# EasyEDA Pro project STM32H723_LTS_2026-05-05.epro, board PCB1
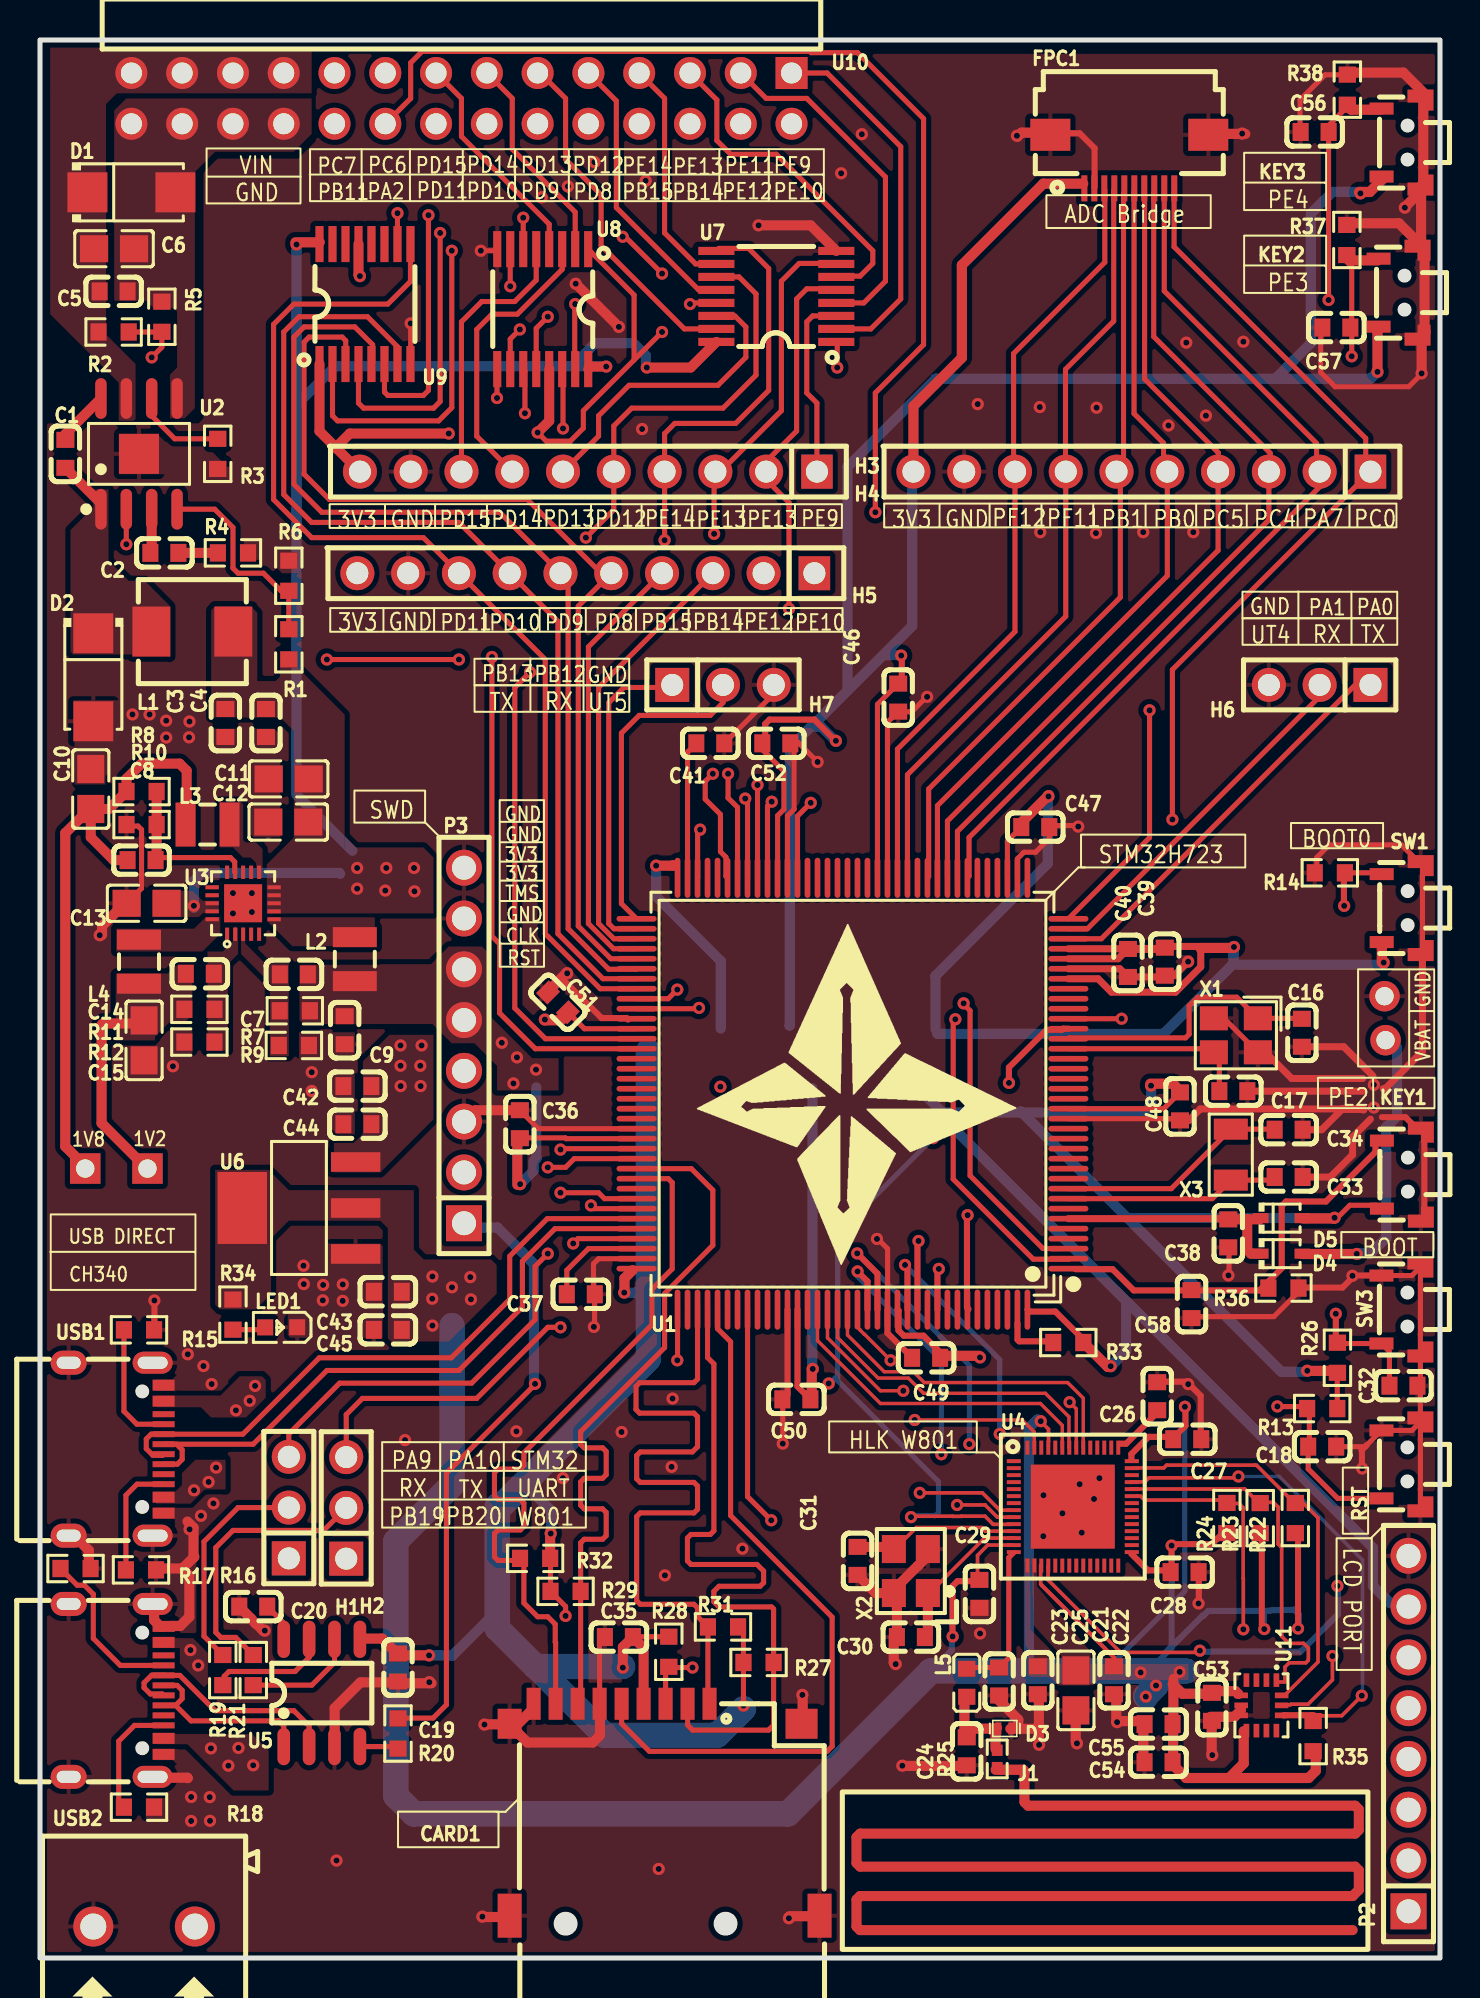
[diagram p4: board, top side]
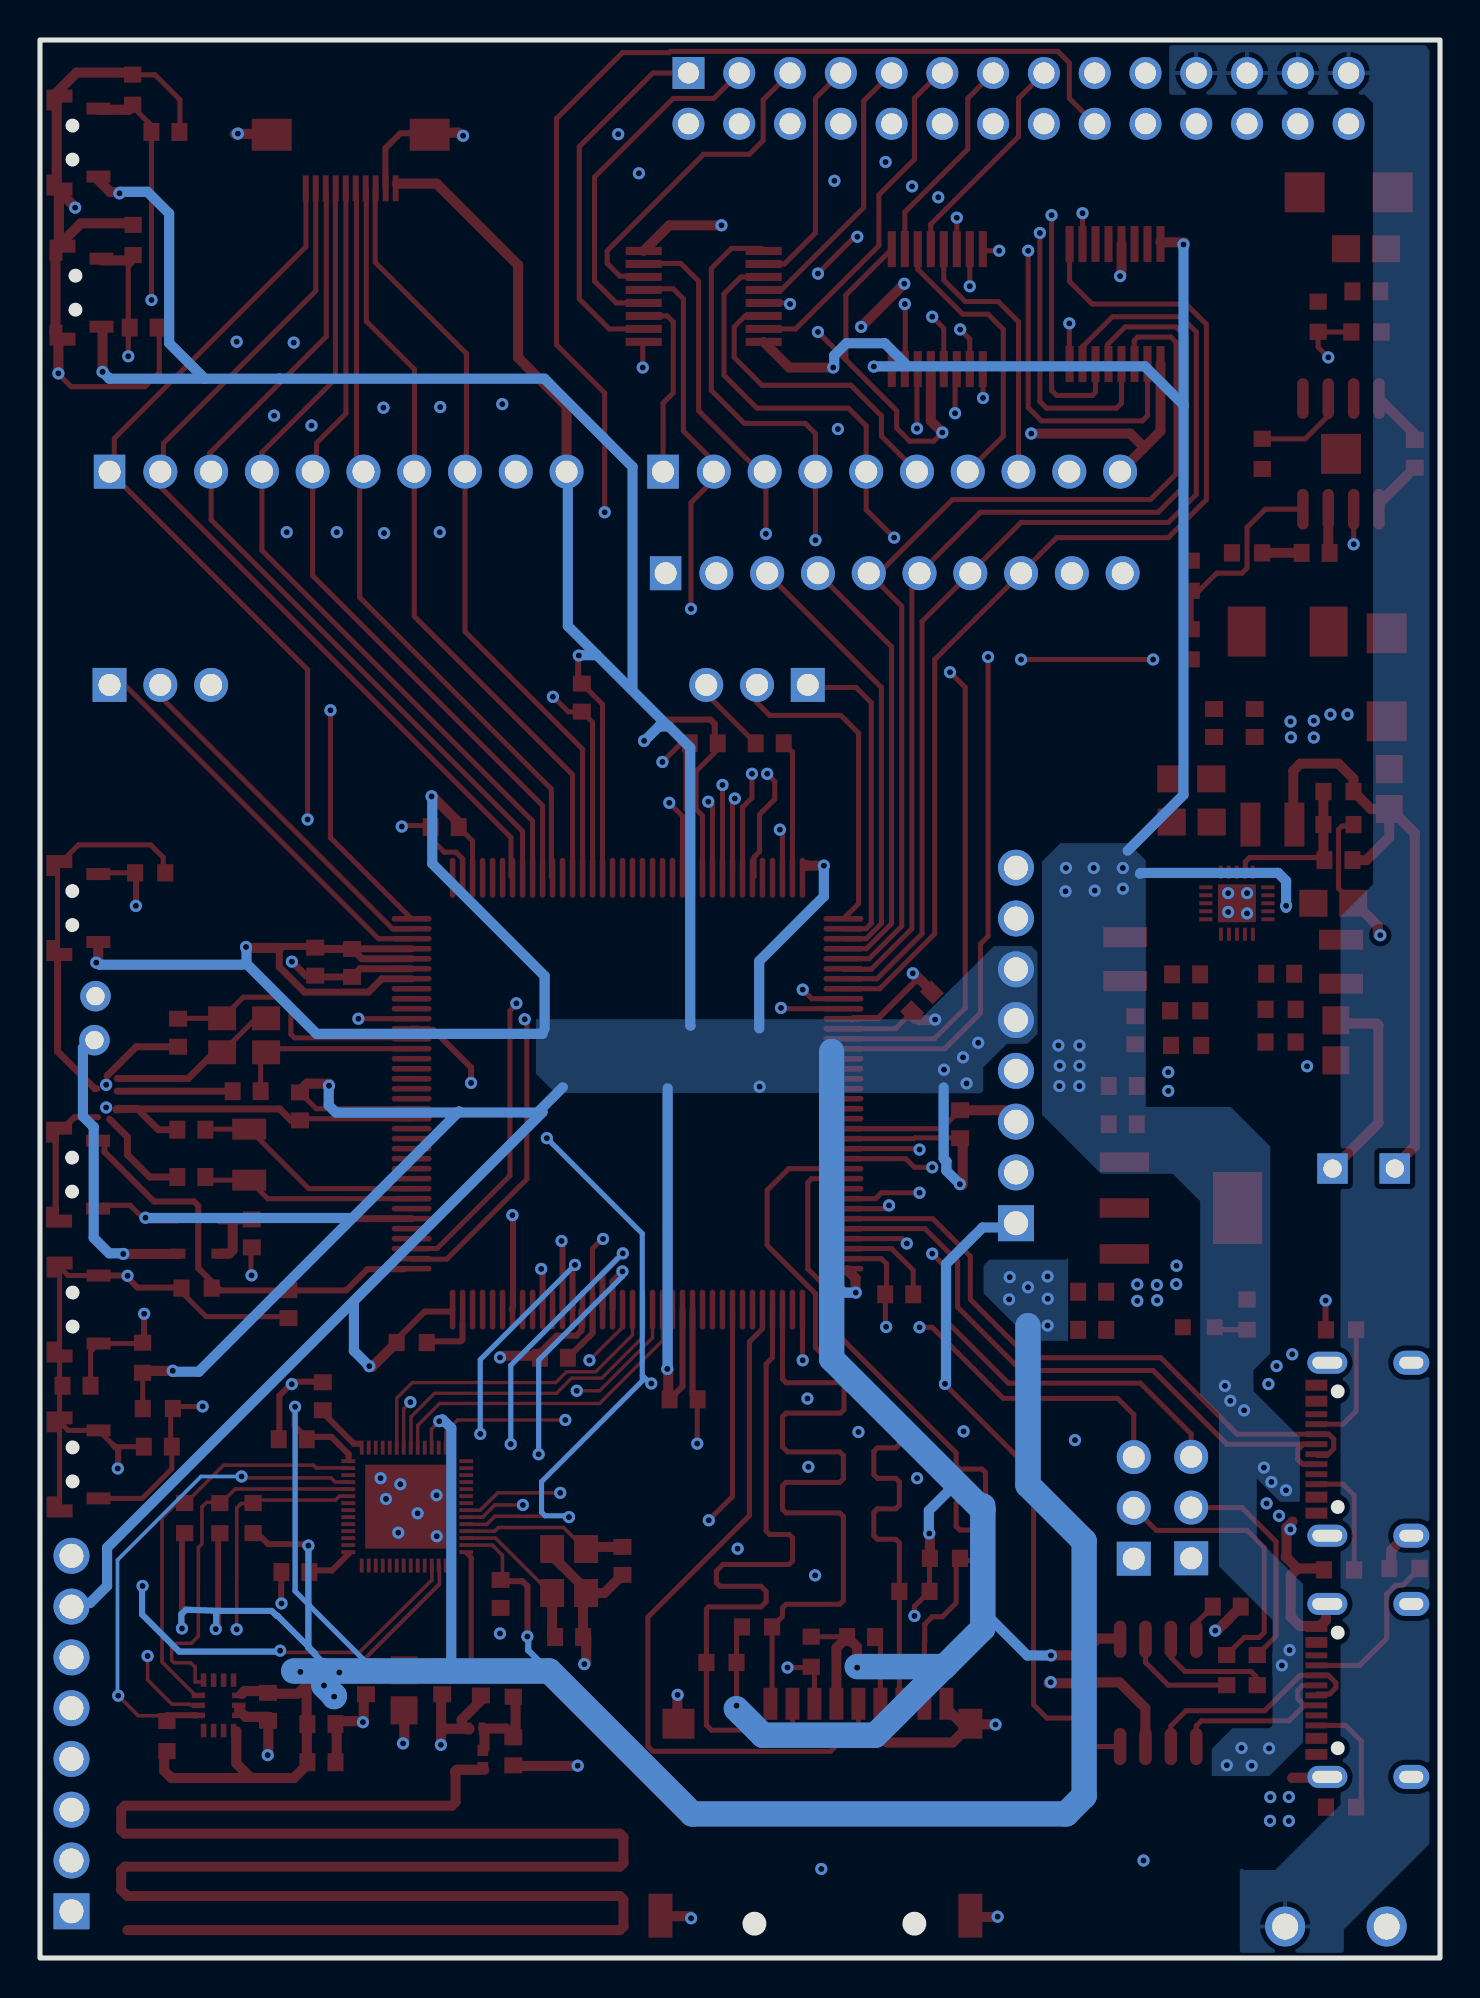
[diagram p5: board, bottom side, seen from below]

Outline 70.03 x 95.94 mm; copper layers: Top Layer, 内层1, 内层2, Bottom Layer. Coordinates in mm from the lower left corner of the outline.
Outline path: rectangle 0,95.94 70.03,0
Stack: Top Layer 0.035mm 外层铜厚1oz / Dielectric1 0.2104mm 7628 RC49% 8.6mil / 内层1 0.0152mm 内层铜厚 / Dielectric2 1.065mm 1.1mm H/HOZ Copper / 内层2 0.0152mm 内层铜厚 / Dielectric3 0.2104mm 7628 RC49% 8.6mil / Bottom Layer 0.035mm 外层铜厚1oz

## Design rules (mm)
template: JLCPCB Capability(Two Layers Board)
spacing copperThickness1oz (default): track to track 0.102, other pairs 0.152 to 0.3
spacing copperThickness2oz: track to track 0.203, other pairs 0.152 to 0.3
track width copperThickness1oz (default): min 0.127, default 0.254, max 2.54
track width copperThickness2oz: min 0.203, default 0.254, max 2.54
differential pair differentialPair (default): width min 0.127, default 0.254, max 2.54; gap min 0.152, default 0.152
via viaSize (default): diameter min 0.5, default 0.61, max 10; hole min 0.3, default 0.305, max 6.3

## Placement (name value [footprint] x y rotation side)
C1  100nF  [C0603]  1.27 75.24 270 top
C2  100pF  [C0603]  6.22 70.28 180 top
C3  100nF  [C0603]  9.27 61.77 90 top
C4  10uF  [C0603]  11.3 61.77 90 top
C5  100nF  [C0603]  3.68 83.36 180 top
C6  22uF  [C0805]  3.7 85.5 180 top
C7  18pF  [C0603]  12.7 49.2 0 top
C8  22pF  [C0603]  5.08 54.92 180 top
C9  10uF  [C0603]  15.24 46.41 90 top
C10  22uF  [C0805]  2.54 58.47 270 top
C11  22uF  [C0805]  12.44 58.98 0 top
C12  22uF  [C0805]  12.42 56.82 0 top
C13  22uF  [C0805]  5.33 52.76 0 top
C14  22pF  [C0603]  7.99 49.23 180 top
C15  22uF  [C0805]  5.21 45.9 90 top
C16  20pF  [C0603]  63.12 46.28 270 top
C17  20pF  [C0603]  59.69 43.36 180 top
C18  100nF  [C0603]  64.14 25.58 0 top
C19  100nF  [C0603]  17.91 14.53 90 top
C20  100nF  [C0603]  10.67 17.58 0 top
C21  47uF  [C0805]  51.82 13.39 90 top
C22  10uF  [C0603]  53.72 13.89 270 top
C23  1.8pF  [C0603]  47.98 13.83 90 top
C24  1pF  [C0603]  46.36 10.34 90 top
C25  10nF  [C0603]  49.91 13.89 90 top
C26  1uF  [C0603]  55.88 28.1 90 top
C27  1uF  [C0603]  57.39 25.95 0 top
C28  1uF  [C0603]  57.25 19.3 0 top
C29  1uF  [C0603]  46.99 18.21 270 top
C30  27pF  [C0603]  43.56 16.05 0 top
C31  27pF  [C0603]  40.89 19.86 270 top
C32  100nF  [C0603]  68.2 28.63 0 top
C33  20pF  [C0603]  62.46 39.06 0 top
C34  20pF  [C0603]  62.46 41.43 0 top
C35  10uF  [C0603]  28.96 16.05 0 top
C36  1uF  [C0603]  24 41.71 270 top
C37  4.7uF  [C0603]  27.05 33.2 0 top
C38  100nF  [C0603]  59.44 36.25 270 top
C39  10uF  [C0603]  56.26 49.84 270 top
C40  100nF  [C0603]  54.42 49.77 90 top
C41  4.7uF  [C0603]  33.53 60.76 180 top
C42  10uF  [C0603]  15.88 43.61 180 top
C43  10uF  [C0603]  17.4 33.33 180 top
C44  100nF  [C0603]  15.88 41.71 180 top
C45  100nF  [C0603]  17.4 31.42 180 top
C46  100nF  [C0603]  42.93 63.04 90 top
C47  100nF  [C0603]  49.78 56.57 180 top
C48  100nF  [C0603]  57.02 42.6 90 top
C49  100nF  [C0603]  44.32 30.02 0 top
C50  100nF  [C0603]  37.83 27.94 0 top
C51  100nF  [C0603]  25.91 47.8 315 top
C52  100nF  [C0603]  36.83 60.76 180 top
C53  10uF  [C0603]  58.62 12.56 90 top
C54  100nF  [C0603]  55.95 9.79 0 top
C55  2.2uF  [C0603]  55.95 11.7 0 top
C56  100nF  [C0603]  63.76 91.34 180 top
C57  100nF  [C0603]  64.84 81.55 0 top
C58  100nF  [C0603]  57.6 32.71 270 top
CARD1  TF PUSH  [TF-SMD_TF-PUSH]  31.24 7.42 0 top
D1  SS34  [SMA_L4.3-W2.6-LS5.2-RD]  4.57 88.32 0 top
D2  SS34  [SMA_L4.3-W2.6-LS5.2-RD]  2.67 64.06 270 top
D3  H5VL10B  [SOD-882_L1.0-W0.6-BI]  48.26 11.48 180 top
D4  B5819WS  [SOD-323_L1.7-W1.3-LS2.5-FD]  62.1 35.23 180 top
D5  B5819WS  [SOD-323_L1.7-W1.3-LS2.5-FD]  62.1 37.01 180 top
FPC1  AFC01-S10FCA-00  [FPC-SMD_P0.5-10P_FGS-XJ-H2.0]  54.49 89.85 0 top
H1  PZ254V-11-03P  [HDR-TH_3P-P2.54-V-M]  12.45 22.53 90 top
H2  PZ254V-11-03P  [HDR-TH_3P-P2.54-V-M]  15.32 22.52 90 top
H3  PZ254V-11-10P  [HDR-TH_10P-P2.54-V-M]  55.12 74.35 180 top
H4  PZ254V-11-10P  [HDR-TH_10P-P2.54-V-M]  27.43 74.35 180 top
H5  PZ254V-11-10P  [HDR-TH_10P-P2.54-V-M]  27.3 69.27 180 top
H6  PZ254V-11-03P  [HDR-TH_3P-P2.54-V-M]  64.01 63.68 180 top
H7  PZ254V-11-03P  [HDR-TH_3P-P2.54-V-M]  34.16 63.68 0 top
J1  Component_1  [TX1]  49.24 9.25 0 top
KEY1  TS24CA  [SW-SMD_TS24CA]  68.1 39.18 270 top
KEY2  TS24CA  [SW-SMD_TS24CA]  67.93 83.3 270 top
KEY3  TS24CA  [SW-SMD_TS24CA]  68.08 90.81 270 top
L1  4.7uH  [IND-SMD_L5.4-W5.2_FXL0530]  7.62 66.35 0 top
L2  2.2uH  [IND-SMD_L2.5-W2.0_MHCHL2520]  15.75 49.96 270 top
L3  2.2uH  [IND-SMD_L2.5-W2.0_MHCHL2520]  8.38 56.69 180 top
L4  2.2uH  [IND-SMD_L2.5-W2.0_MHCHL2520]  4.95 49.84 270 top
L5  3nH  [L0603]  46.36 13.77 90 top
LED1  NCD0603R1  [LED0603-RD_RED]  12.06 31.55 180 top
NOREF  -  [Pad_e2978]  67.25 48.11 0 top
NOREF#2  -  [Pad_e5774]  5.38 39.49 0 top
NOREF#3  -  [Pad_e5768]  2.26 39.49 0 top
NOREF#4  -  [Pad_e2976]  67.3 45.91 0 top
P1  WJ500V-5.08-2P  [CONN-TH_2P-P5.00_WJ500V-5.08-2P]  5.21 1.58 180 top
P2  2.54-1*8P母环保  [HDR-TH_8P-P2.54-V-F-1]  68.45 11.23 90 top
P3  2.54-1*8P母环保  [HDR-TH_8P-P2.54-V-F-1]  21.21 45.64 90 top
R1  500kΩ  [R0603]  12.45 65.71 270 top
R2  100kΩ  [R0603]  3.68 81.33 180 top
R3  100kΩ  [R0603]  8.89 75.24 90 top
R4  100kΩ  [R0603]  9.65 70.28 180 top
R5  100kΩ  [R0603]  6.1 82.09 270 top
R6  100kΩ  [R0603]  12.45 69.14 270 top
R7  680kΩ  [R0603]  12.75 47.38 0 top
R8  300kΩ  [R0603]  5.08 58.34 180 top
R9  150kΩ  [R0603]  12.7 45.64 180 top
R10  150kΩ  [R0603]  5.08 56.69 0 top
R11  150kΩ  [R0603]  7.97 47.45 180 top
R12  150kΩ  [R0603]  7.97 45.81 0 top
R13  10kΩ  [R0603]  64.14 27.48 0 top
R14  10kΩ  [R0603]  64.52 54.28 0 top
R15  5.1kΩ  [R0603]  4.95 31.42 180 top
R16  5.1kΩ  [R0603]  5.05 19.41 180 top
R17  5.1kΩ  [R0603]  1.78 19.48 180 top
R18  5.1kΩ  [R0603]  4.95 7.54 180 top
R19  510Ω  [R0603]  9.14 14.4 90 top
R20  10kΩ  [R0603]  17.91 11.23 270 top
R21  510Ω  [R0603]  10.67 14.4 90 top
R22  10kΩ  [R0603]  62.79 22.01 90 top
R23  10kΩ  [R0603]  61.03 22 90 top
R24  10kΩ  [R0603]  59.37 22.01 90 top
R25  0Ω  [R0402]  47.88 9.96 90 top
R26  10kΩ  [R0603]  64.9 30.02 270 top
R27  10kΩ  [R0603]  35.94 14.78 0 top
R28  10kΩ  [R0603]  31.45 15.32 270 top
R29  10kΩ  [R0603]  26.29 18.34 0 top
R31  10kΩ  [R0603]  34.16 16.56 180 top
R32  10kΩ  [R0603]  24.77 19.99 180 top
R33  10kΩ  [R0603]  51.43 30.79 0 top
R34  470Ω  [R0603]  9.65 32.18 90 top
R35  10kΩ  [R0603]  63.68 11.1 90 top
R36  10kΩ  [R0603]  62.2 33.51 180 top
R37  10kΩ  [R0603]  65.37 85.93 270 top
R38  10kΩ  [R0603]  65.39 93.45 270 top
RST  TS24CA  [SW-SMD_TS24CA]  68.07 24.69 270 top
SW1  TS24CA  [SW-SMD_TS24CA]  68.09 52.52 270 top
SW3  TS24CA  [SW-SMD_TS24CA]  68.07 32.44 270 top
U1  STM32H723ZGT6  [LQFP-144_L20.0-W20.0-P0.50-LS22.0-BL]  40.64 43.23 90 top
U2  MP1584EN-LF-Z  [SOIC-8_L5.0-W4.0-P1.27-LS6.0-BL-EP2.0]  4.95 75.24 0 top
U3  TMI7003C  [QFN-20_L3.0-W3.0-P0.40-BL-EP1.9]  10.16 52.76 0 top
U4  W801_QFN56  [QFN-56]  51.66 22.58 0 top
U5  CH340N  [SOP-8_L4.9-W3.9-P1.27-LS6.0-BL]  14.1 13.26 0 top
U6  AMS1117-3.3  [SOT-223-4_L6.5-W3.5-P2.30-LS7.0-BR]  12.95 37.52 0 top
U7  CD4504BPWR  [TSSOP-16_L5.0-W4.4-P0.65-LS6.4-TL]  36.83 83.11 180 top
U8  CD4504BPWR  [TSSOP-16_L5.0-W4.4-P0.65-LS6.4-TL]  25.15 82.47 270 top
U9  CD4504BPWR  [TSSOP-16_L5.0-W4.4-P0.65-LS6.4-TL]  16.26 82.73 90 top
U10  PZ254-2-14-W-2.5-G1  [HDR-TH_28P-P2.54-H-M-R2-C14-S2.54]  21.08 93.02 180 top
U11  ICM-42688-P  [LGA-14_L3.0-W2.5-P0.50-TL]  61.09 12.64 270 top
USB1  TYPE-C 16PIN 2MD(073)  [USB-C-SMD_TYPE-C-6PIN-2MD-073]  3.81 25.45 270 top
USB2  TYPE-C 16PIN 2MD(073)  [USB-C-SMD_TYPE-C-6PIN-2MD-073]  3.81 13.39 270 top
X1  25MHz  [CRYSTAL-SMD_4P-L3.2-W2.5-BL]  59.82 46.15 180 top
X2  40MHz  [OSC-SMD_4P-L3.2-W2.5-BL_SIT8008BI]  43.56 19.36 90 top
X3  32.768kHz  [CRYSTAL-SMD_L3.2-W1.5-1]  59.56 40.18 270 top

## Footprints (pads in the part's own frame, mm; a bottom-side part is the same pattern mirrored in y, then rotated)
C0603
  rect 0.8x0.9 smd: 1(-0.7,0) 2(0.7,0)
C0805
  rect 1.41x1.35 smd: 1(-1,0) 2(1,0)
CONN-TH_2P-P5.00_WJ500V-5.08-2P
  round 2 hole 1.3: 1(-2.54,0) 2(2.54,0)
CRYSTAL-SMD_4P-L3.2-W2.5-BL
  rect 1.4x1.2 smd: 1(-1.1,-0.85) 2(1.1,-0.85) 3(1.1,0.85) 4(-1.1,0.85)
CRYSTAL-SMD_L3.2-W1.5-1
  rect 1.05x1.7 smd: 1(-1.275,0) 2(1.275,0)
FPC-SMD_P0.5-10P_FGS-XJ-H2.0
  rect 0.3x1.3 smd: 1(-2.25,-1.339) 2(-1.75,-1.339) 3(-1.25,-1.34) 4(-0.75,-1.339) 5(-0.25,-1.34) 6(0.25,-1.339) 7(0.75,-1.339) 8(1.25,-1.339) 9(1.75,-1.339) 10(2.25,-1.34)
  rect 2x1.6 smd: 11(3.95,1.34) 12(-3.95,1.34)
HDR-TH_3P-P2.54-V-M
  rect 1.7x1.7 hole 1.1: 1(-2.54,0)
  round 1.7 hole 1.1: 2(0,0) 3(2.54,0)
HDR-TH_8P-P2.54-V-F-1
  rect 1.8x1.8 hole 1.2: 1(-8.89,0)
  round 1.8 hole 1.2: 2(-6.35,0) 3(-3.81,0) 4(-1.27,0) 5(1.27,0) 6(3.81,0) 7(6.35,0) 8(8.89,0)
HDR-TH_10P-P2.54-V-M
  rect 1.575x1.7 hole 1.1: 1(-11.43,0)
  round 1.7 hole 1.1: 2(-8.89,0) 3(-6.35,0) 4(-3.81,0) 5(-1.27,0) 6(1.27,0) 7(3.81,0) 8(6.35,0) 9(8.89,0) 10(11.43,0)
HDR-TH_28P-P2.54-H-M-R2-C14-S2.54
  rect 1.6x1.6 hole 1.05: 1(-16.51,-1.27)
  round 1.6 hole 1.05: 2(-16.51,1.27) 3(-13.97,-1.27) 4(-13.97,1.27) 5(-11.43,-1.27) 6(-11.43,1.27) 7(-8.89,-1.27) 8(-8.89,1.27) 9(-6.35,-1.27) 10(-6.35,1.27) 11(-3.81,-1.27) 12(-3.81,1.27) 13(-1.27,-1.27) 14(-1.27,1.27) 15(1.27,-1.27) 16(1.27,1.27) 17(3.81,-1.27) 18(3.81,1.27) 19(6.35,-1.27) 20(6.35,1.27) 21(8.89,-1.27) 22(8.89,1.27) 23(11.43,-1.27) 24(11.43,1.27) 25(13.97,-1.27) 26(13.97,1.27) 27(16.51,-1.27) 28(16.51,1.27)
IND-SMD_L2.5-W2.0_MHCHL2520
  rect 1x2.2 smd: 1(-1.1,0) 2(1.1,0)
IND-SMD_L5.4-W5.2_FXL0530
  rect 1.9x2.5 smd: 1(-2.05,0) 2(2.05,0)
L0603
  rect 0.8x0.864 smd: 1(-0.7,0) 2(0.7,0)
LED0603-RD_RED
  rect 0.8x0.8 smd: 1(-0.799,-0.004) 2(0.799,0.004)
LGA-14_L3.0-W2.5-P0.50-TL
  rect 0.675x0.28 smd: 1(-1.262,0.75) 2(-1.262,0.25) 3(-1.262,-0.25) 4(-1.262,-0.75) 8(1.262,-0.75) 9(1.262,-0.25) 10(1.262,0.25) 11(1.262,0.75)
  rect 0.28x0.675 smd: 5(-0.5,-1.012) 6(0,-1.012) 7(0.5,-1.012) 12(0.5,1.012) 13(0,1.012) 14(-0.5,1.012)
LQFP-144_L20.0-W20.0-P0.50-LS22.0-BL
  oval 0.28x2 smd: 1(-8.75,-10.8) 2(-8.25,-10.8) 3(-7.75,-10.8) 4(-7.25,-10.8) 5(-6.75,-10.8) 6(-6.25,-10.8) 7(-5.75,-10.8) 8(-5.25,-10.8) 9(-4.75,-10.8) 10(-4.25,-10.8) 11(-3.75,-10.8) 12(-3.25,-10.8) 13(-2.75,-10.8) 14(-2.25,-10.8) 15(-1.75,-10.8) 16(-1.25,-10.8) 17(-0.75,-10.8) 18(-0.25,-10.8) 19(0.25,-10.8) 20(0.75,-10.8) 21(1.25,-10.8) 22(1.75,-10.8) 23(2.25,-10.8) 24(2.75,-10.8) 25(3.25,-10.8) 26(3.75,-10.8) 27(4.25,-10.8) 28(4.75,-10.8) 29(5.25,-10.8) 30(5.75,-10.8) 31(6.25,-10.8) 32(6.75,-10.8) 33(7.25,-10.8) 34(7.75,-10.8) 35(8.25,-10.8) 36(8.75,-10.8) 73(8.75,10.8) 74(8.25,10.8) 75(7.75,10.8) 76(7.25,10.8) 77(6.75,10.8) 78(6.25,10.8) 79(5.75,10.8) 80(5.25,10.8) 81(4.75,10.8) 82(4.25,10.8) 83(3.75,10.8) 84(3.25,10.8) 85(2.75,10.8) 86(2.25,10.8) 87(1.75,10.8) 88(1.25,10.8) 89(0.75,10.8) 90(0.25,10.8) 91(-0.25,10.8) 92(-0.75,10.8) 93(-1.25,10.8) 94(-1.75,10.8) 95(-2.25,10.8) 96(-2.75,10.8) 97(-3.25,10.8) 98(-3.75,10.8) 99(-4.25,10.8) 100(-4.75,10.8) 101(-5.25,10.8) 102(-5.75,10.8) 103(-6.25,10.8) 104(-6.75,10.8) 105(-7.25,10.8) 106(-7.75,10.8) 107(-8.25,10.8) 108(-8.75,10.8)
  oval 2x0.28 smd: 37(10.8,-8.75) 38(10.8,-8.25) 39(10.8,-7.75) 40(10.8,-7.25) 41(10.8,-6.75) 42(10.8,-6.25) 43(10.8,-5.75) 44(10.8,-5.25) 45(10.8,-4.75) 46(10.8,-4.25) 47(10.8,-3.75) 48(10.8,-3.25) 49(10.8,-2.75) 50(10.8,-2.25) 51(10.8,-1.75) 52(10.8,-1.25) 53(10.8,-0.75) 54(10.8,-0.25) 55(10.8,0.25) 56(10.8,0.75) 57(10.8,1.25) 58(10.8,1.75) 59(10.8,2.25) 60(10.8,2.75) 61(10.8,3.25) 62(10.8,3.75) 63(10.8,4.25) 64(10.8,4.75) 65(10.8,5.25) 66(10.8,5.75) 67(10.8,6.25) 68(10.8,6.75) 69(10.8,7.25) 70(10.8,7.75) 71(10.8,8.25) 72(10.8,8.75) 109(-10.8,8.75) 110(-10.8,8.25) 111(-10.8,7.75) 112(-10.8,7.25) 113(-10.8,6.75) 114(-10.8,6.25) 115(-10.8,5.75) 116(-10.8,5.25) 117(-10.8,4.75) 118(-10.8,4.25) 119(-10.8,3.75) 120(-10.8,3.25) 121(-10.8,2.75) 122(-10.8,2.25) 123(-10.8,1.75) 124(-10.8,1.25) 125(-10.8,0.75) 126(-10.8,0.25) 127(-10.8,-0.25) 128(-10.8,-0.75) 129(-10.8,-1.25) 130(-10.8,-1.75) 131(-10.8,-2.25) 132(-10.8,-2.75) 133(-10.8,-3.25) 134(-10.8,-3.75) 135(-10.8,-4.25) 136(-10.8,-4.75) 137(-10.8,-5.25) 138(-10.8,-5.75) 139(-10.8,-6.25) 140(-10.8,-6.75) 141(-10.8,-7.25) 142(-10.8,-7.75) 143(-10.8,-8.25) 144(-10.8,-8.75)
OSC-SMD_4P-L3.2-W2.5-BL_SIT8008BI
  rect 1.4x1.2 smd: 1(-1.1,-0.85) 2(1.1,-0.85) 3(1.1,0.85) 4(-1.1,0.85)
Pad_e2976
  round 1.524 hole 0.914: 1(0,0)
Pad_e2978
  round 1.524 hole 0.914: 1(0,0)
Pad_e5768
  rect 1.524x1.524 hole 0.914: 1(0,0)
Pad_e5774
  rect 1.524x1.524 hole 0.914: 1(0,0)
QFN-20_L3.0-W3.0-P0.40-BL-EP1.9
  rect 0.2x0.665 smd: 1(-0.8,-1.55) 2(-0.4,-1.55) 3(0,-1.55) 4(0.4,-1.55) 5(0.8,-1.55) 11(0.8,1.55) 12(0.4,1.55) 13(0,1.55) 14(-0.4,1.55) 15(-0.8,1.55)
  rect 0.665x0.2 smd: 6(1.55,-0.8) 7(1.55,-0.4) 8(1.55,0) 9(1.55,0.4) 10(1.55,0.8) 16(-1.55,0.8) 17(-1.55,0.4) 18(-1.55,0) 19(-1.55,-0.4) 20(-1.55,-0.8)
  rect 1.9x1.9 smd: 21(0,0)
QFN-56
  rect 0.7x0.195 smd: 1(-2.95,2.275) 2(-2.95,1.925) 3(-2.95,1.575) 4(-2.95,1.225) 5(-2.95,0.875) 6(-2.95,0.525) 7(-2.95,0.175) 8(-2.95,-0.175) 9(-2.95,-0.525) 10(-2.95,-0.875) 11(-2.95,-1.225) 12(-2.95,-1.575) 13(-2.95,-1.925) 14(-2.95,-2.275) 29(2.95,-2.275) 30(2.95,-1.925) 31(2.95,-1.575) 32(2.95,-1.225) 33(2.95,-0.875) 34(2.95,-0.525) 35(2.95,-0.175) 36(2.95,0.175) 37(2.95,0.525) 38(2.95,0.875) 39(2.95,1.225) 40(2.95,1.575) 41(2.95,1.925) 42(2.95,2.275)
  rect 0.195x0.7 smd: 15(-2.275,-2.95) 16(-1.925,-2.95) 17(-1.575,-2.95) 18(-1.225,-2.95) 19(-0.875,-2.95) 20(-0.525,-2.95) 21(-0.175,-2.95) 22(0.175,-2.95) 23(0.525,-2.95) 24(0.875,-2.95) 25(1.225,-2.95) 26(1.575,-2.95) 27(1.925,-2.95) 28(2.275,-2.95) 43(2.275,2.95) 44(1.925,2.95) 45(1.575,2.95) 46(1.225,2.95) 47(0.875,2.95) 48(0.525,2.95) 49(0.175,2.95) 50(-0.175,2.95) 51(-0.525,2.95) 52(-0.875,2.95) 53(-1.225,2.95) 54(-1.575,2.95) 55(-1.925,2.95) 56(-2.275,2.95)
  rect 4.2x4.2 smd: 57(0,0)
R0402
  rect 0.566x0.54 smd: 1(-0.433,0) 2(0.433,0)
R0603
  rect 0.806x0.864 smd: 1(-0.753,0) 2(0.753,0)
SMA_L4.3-W2.6-LS5.2-RD
  rect 2x2 smd: 1(-2.2,0) 2(2.2,0)
SOD-323_L1.7-W1.3-LS2.5-FD
  rect 0.78x0.5 smd: 1(-1.04,0) 2(1.04,0)
SOD-882_L1.0-W0.6-BI
  rect 0.3x0.6 smd: 1(-0.325,0) 2(0.325,0)
SOIC-8_L5.0-W4.0-P1.27-LS6.0-BL-EP2.0
  oval 0.574x2.038 smd: 1(-1.905,-2.769) 2(-0.635,-2.769) 3(0.635,-2.769) 4(1.905,-2.769) 5(1.905,2.769) 6(0.635,2.769) 7(-0.635,2.769) 8(-1.905,2.769)
  rect 2x2 smd: 9(0,0)
SOP-8_L4.9-W3.9-P1.27-LS6.0-BL
  oval 0.63x1.865 smd: 1(-1.905,-2.683) 2(-0.635,-2.683) 3(0.635,-2.683) 4(1.905,-2.683) 5(1.905,2.683) 6(0.635,2.683) 7(-0.635,2.683) 8(-1.905,2.683)
SOT-223-4_L6.5-W3.5-P2.30-LS7.0-BR
  rect 2.47x0.98 smd: 1(2.835,-2.3) 2(2.835,0) 3(2.835,2.3)
  rect 2.47x3.6 smd: 4(-2.835,0)
SW-SMD_TS24CA
  custom 1.05x1.3 smd: 1(-2.125,0.975) 2(2.125,0.975)
  rect 0.6x1.2 smd: 3(-1.7,-0.975) 4(1.7,-0.975)
TF-SMD_TF-PUSH
  rect 0.7x1.6 smd: 1(2.25,5.3) 2(1.15,5.3) 3(0.05,5.3) 4(-1.05,5.3) 5(-2.15,5.3) 6(-3.25,5.3) 7(-4.35,5.3) 8(-5.45,5.3) CD(-6.55,5.3)
  rect 1.2x1.5 smd: 10(-7.75,4.3)
  rect 1.2x2.2 smd: 11(-7.75,-5.3) 12(7.75,-5.3)
  rect 1.6x1.5 smd: 13(6.85,4.3)
TSSOP-16_L5.0-W4.4-P0.65-LS6.4-TL
  rect 1.804x0.406 smd: 1(-3,2.275) 2(-3,1.625) 3(-3,0.975) 4(-3,0.325) 5(-3,-0.325) 6(-3,-0.975) 7(-3,-1.625) 8(-3,-2.275) 9(3,-2.275) 10(3,-1.625) 11(3,-0.975) 12(3,-0.325) 13(3,0.325) 14(3,0.975) 15(3,1.625) 16(3,2.275)
TX1
  rect 0.254x0.254 smd: 1(0,0)
USB-C-SMD_TYPE-C-6PIN-2MD-073
  rect 0.55x1.1 smd: 1(-3.2,2.375) 2(-2.4,2.375) 11(2.4,2.375) 12(3.2,2.375)
  rect 0.3x1.1 smd: 3(-1.75,2.375) 4(-1.25,2.375) 5(-0.75,2.375) 6(-0.25,2.375) 7(0.25,2.375) 8(0.75,2.375) 9(1.25,2.375) 10(1.75,2.375)
  oval 1.1x2 hole 0.6x1.5: 13(-4.325,1.825) 14(4.325,1.825)
  oval 1.2x1.8 hole 0.6x1.2: 13(-4.325,-2.375) 14(4.325,-2.375)

## Nets
As in the schematic, except:
1V2: C14.2 C15.2 L4.2 NOREF#2.1 R11.2
1V8: C8.2 C10.2 L3.2 NOREF#3.1 R8.2
GND: C3.1 C4.1 C5.1 C6.1 C9.1 C10.1 C11.1 C12.1 C13.1 C15.1 C16.2 C17.1 C18.2 C19.1 C20.1 C21.1 C22.2 C23.1 C24.1 C25.1 C26.2 C27.2 C28.2 C29.2 C30.1 C31.2 C32.2 C33.2 C34.2 C35.1 C36.1 C37.2 C38.2 C39.2 C40.1 C41.1 C42.2 C43.2 C44.2 C45.2 C46.1 C47.1 C48.1 C49.1 C50.1 C51.1 C52.1 C53.1 C54.1 C55.1 C56.2 C57.1 C58.2 CARD1.6 CARD1.10 CARD1.11 CARD1.12 CARD1.13 CARD1.CD D1.2 D2.2 D3.1 FPC1.2 FPC1.11 FPC1.12 H3.9 H4.9 H5.9 H6.3 H7.3 KEY1.1 KEY1.2 KEY2.1 KEY2.2 KEY3.1 KEY3.2 LED1.1 NOREF.1 P1.2 P2.8 P3.3 P3.7 P3.8 R3.1 R4.1 R5.1 R6.1 R9.1 R10.1 R12.1 R14.1 R15.1 R16.1 R17.1 R18.1 R36.1 R37.1 R38.1 RST.1 RST.2 RST.3 SW1.1 SW1.2 SW3.1 SW3.2 SW3.3 U1.16 U1.31 U1.38 U1.51 U1.61 U1.83 U1.94 U1.107 U1.120 U1.130 U2.5 U2.9 U3.21 U4.57 U5.3 U6.1 U7.8 U8.8 U9.8 U10.22 U10.24 U10.26 U10.28 U11.6 U11.7 USB1.1 USB1.12 USB1.13 USB1.14 USB2.1 USB2.12 USB2.13 USB2.14 X1.2 X1.4 X2.2 X2.4
VBAT: D4.1 NOREF#4.1
PB4_LSPI_CS: R35.2 U4.39 U11.12

Pads without a net: P2 1; U1 4 5 7 10 11 12 13 14 15 18 19 20 21 22 27 28 29 37 40 41 42 48 53 54 55 56 57 58 59 68 69 87 88 89 90 91 92 93 100 110 114 115 117 118 119 122 134 136 137 139 140 141 142; U3 1 4 5 12 13 15 16 17; U4 40; U9 11 12 14 15; U11 2 3 4 9 10 11; USB1 3 9; USB2 3 9

## Via types
v1: diameter 0.61, hole 0.305, Top Layer to Bottom Layer, 261 vias

## Routing (per net, layer and track width the routed paths; a pad name or vN(x,y) marks a point on that pad's centre or on a via; arc(x,y) is an arc through that point)
1V2: length 10
  Top Layer w0.508: 5.38,39.46 3.08,41.76 3.08,46.67 3.15,46.74 4.86,46.74
1V8: length 31.2
  Top Layer w0.5: L3.2 7.34,56.75 7.34,59.39 6.98,59.74 5.08,59.74 4.33,58.99 R8.2 3.45,57.47 C10.2 2.54,56.06 3.68,54.92 C8.2
  Top Layer w0.508: 2.31,57.31 1.26,56.26 1.26,40.6 2.25,39.61
3V32: length 541.7
  Top Layer w0.254: v1(35.19,12.62) R27.1 35.19,16.29 R31.1 ; 29.72,79.93 v1(31.11,81.33) ; 29.72,79.93 29.72,83.18 U8.1 ; 29.72,79.93 27.18,77.39 27.18,76.52 26.53,75.87 25.32,75.87 v1(24.89,76.3) ; v1(32.51,82.73) 32.57,82.78 U7.13 ; C51.2 27.23,46.48 U1.84 ; 64.85,36.98 65.52,37.65 66.84,37.65 66.94,37.55 ; 36.89,54.03 36.89,54.03 36.89,57.14 37.21,57.46 37.21,59.36 36.13,60.44 C52.2 ; R28.1 29.67,16.07 ; R13.2 64.89,29.26 R26.2 ; v1(26.29,17.11) 26.29,17.59 R29.1 25.54,19.97 R32.1 ; U7.1 39.88,80.79 v1(39.88,79.55) ; 51.44,42.48 56.21,42.48 C48.2 ; U1.95 26.32,40.98 26.28,41.02 24.02,41.02 ; 41.89,54.03 41.89,62.71 C46.2 ; 49.08,56.57 48.39,55.87 48.39,54.03
  Top Layer w0.305: 39.75,60.93 38.74,61.94 36.49,61.94 36.28,61.73 36.28,60.68 36.21,60.61 ; C49.2 45.02,30.3 44.19,31.13 43.21,31.13 42.95,31.39 42.95,32.38 U1.131 ; C50.2 37.89,28.59 U1.121 ; 43.09,63.75 43.11,63.77 43.11,65.07 ; 52.33,30.8 52.32,30.8 50.79,32.33 49.5,32.33 49.39,32.44
  Top Layer w0.35: 51.44,50.48 54.41,50.48 C40.2 53.93,49.98 51.44,49.98 ; 51.44,48.98 52.92,48.98 53.59,48.31 56.8,48.31 58.06,49.57 58.06,50.49 57.95,50.6 56.32,50.6 C39.1
  Top Layer w0.4: C39.1 56.2,50.47 C40.2
  Top Layer w0.5: CARD1.4 30.19,15.52 C35.2 29.15,15.55 v1(29.15,14.52) ; 14.86,75.49 14.86,75.62 15.49,76.25 v1(20.45,76.25) ; 14.86,75.49 H4.10 ; 14.86,75.49 13.98,76.37 U9.1 ; v1(16,84.13) 15.93,84.2 U9.13 ; v1(24.89,76.3) 25.47,76.88 U8.13
  Top Layer w0.508: 29.64,34.4 29.23,34 29.23,33.36 ; 67.17,50.69 67.12,50.64 67.12,49.78 ; 17.89,15.17 17.92,15.14 19.45,15.14 ; 25.39,46.9 26.07,46.9 26.44,47.27 26.47,47.3 ; 38.54,28.02 38.6,28.08 38.6,29.49 ; 63.17,36.99 64.72,36.99 v1(64.75,37.03) ; 43.69,74.7 43.69,77.62 46.11,80.04 46.11,84.68 50.18,88.75 52.18,88.75 ; 25.47,20.12 25.52,20.17 25.52,21.3 ; 65.98,88.33 66.52,88.33 67.17,88.99 ; 50.46,58.17 49.01,56.72 48.98,56.72 ; 53.52,29.56 53.41,29.56 52.12,30.85 ; 63.34,29.37 64.81,29.37 64.9,29.27 ; 31.68,54.67 31.65,54.64 v1(30.82,54.64) ; 17.91,15.19 17.12,15.98 16.06,15.98 ; 45,30.06 45.02,30.08 45.06,30.12 46.98,30.12 ; 59.64,50.52 58.03,50.52 ; 23.94,41 23.88,40.94 23.88,38.68 ; 56.95,43.45 56.67,43.73 55.54,43.73 ; 66.87,81.41 66.9,81.38 v1(66.9,79.34)
  内层2 w0.254: v1(32.51,82.73) v1(31.11,81.33) 32.89,79.55 v1(39.88,79.55)
  内层2 w0.5: 26.68,14.52 26.29,14.91 v1(26.29,17.11) ; 26.68,14.52 v1(29.15,14.52) ; 26.68,14.52 26.68,12.24 27.94,10.97 33.54,10.97 v1(35.19,12.62) ; H5.10 15.88,74.22 H4.10 v1(16,84.13) ; v1(20.45,76.25) 24.84,76.25 v1(24.89,76.3) ; H3.10 43.69,75.74 v1(39.88,79.55)
  内层2 w0.508: 34.03,43.55 40.9,36.68 42.16,36.68 42.58,36.26 42.58,35.67 42.56,35.65 42.56,34.37 42.97,33.96 43.63,33.96 47.02,30.56 v1(47.02,30.04)
  Bottom Layer w0.508: 24.51,23.44 25.57,22.38 25.57,21.24 ; 49.12,42.29 62.08,29.33 63.38,29.33 ; 49.12,42.29 49.06,42.35 ; 49.12,42.29 55.23,42.29 55.59,42.65 55.59,43.6 ; 49.12,42.29 45.14,42.29 43.88,43.55 ; 53.57,29.61 54.33,30.37 54.33,32.86 ; 39.84,60.83 39.07,61.6 38.56,61.6 37.5,60.54 37.5,46.65 37.48,46.63 ; v1(30.82,54.64) 30.82,53.1 34.05,49.87 34.05,46.49 ; 38.62,61.62 42.17,65.17 43.05,65.17 ; 59.86,49.69 67.05,49.69 67.14,49.78 ; 58.04,78.99 44.8,78.99 40.39,74.59 40.39,63.53 ; 58.04,78.99 58.02,78.97 ; 58.04,78.99 61.79,78.99 ; 61.79,78.99 66.56,78.99 v1(66.9,79.34) ; 61.79,78.99 63.57,80.77 63.57,87.26 64.65,88.34 66.03,88.34 66.1,88.27 ; 68.58,17.42 68.24,17.77 67.52,17.77 66.67,18.61 66.67,20.52 44.88,42.32 ; 19.47,15.13 20.64,15.13 22.7,17.19 ; 50.41,58.14 50.41,54.74 44.79,49.12 44.79,46.46 ; 54.53,37.01 64.74,37.01 v1(64.75,37.03) ; 24.83,43.55 24.83,39.98 24.69,39.84 24.69,39.38 v1(24.02,38.71) ; 42.25,65.24 43.62,66.62 43.62,74.25 ; 30.18,33.62 29.84,33.28 29.28,33.28 ; 44.88,46.22 56.19,46.22 59.7,49.73 59.7,50.48 ; v1(38.65,29.46) 38.63,29.48 38.63,43.5
  Bottom Layer w1.27: 29.15,14.58 24.78,14.58 22.87,16.49 22.87,22.41 ; 24.95,14.5 24.95,14.44 28.24,11.14 33.87,11.14 35.2,12.47 ; 22.87,22.41 30.43,29.97 30.43,45.35 ; 22.87,22.41 22.87,22.61
  vias: v1(19.46,15.14) v1(23.1,45.78) v1(23.68,43.74) v1(23.86,45.05) v1(24.81,44.43) v1(25.25,46.94) v1(25.55,21.23) v1(29.22,33.28) v1(34.03,43.58) v1(39.81,60.88) v1(43.08,65.15) v1(50.44,58.1) v1(53.56,29.6) v1(55.57,43.63) v1(59.72,50.57) v1(63.39,29.37) v1(66.05,88.26) v1(67.21,49.79)
3V32_2: length 166.9
  Top Layer w0.18: 50.05,19.67 50.05,18.7 50.1,18.65 ; 50.45,25.82 50.45,26.45 50.06,26.84 ; 46.9,19.18 46.9,20.14 47.4,20.66 ; 47.41,20.65 47.42,20.66 48.61,20.66
  Top Layer w0.203: 53.73,14.71 53.73,15.02 50.1,18.65
  Top Layer w0.3: v1(62.93,16.48) 62.93,21.29 62.95,21.3 ; 57.3,27.52 57.3,26.62 56.71,26.04 ; 61.11,21.24 61.11,16.69 61.21,16.59 ; 56.52,20.58 56.6,20.5 56.6,19.3 ; 56.64,20.7 58.61,20.7 59.1,21.19
  Top Layer w0.305: 54.59,24.94 54.59,25.21 55.45,26.07 56.61,26.07 ; 45.64,16.07 45.64,18.6 45.89,18.85 46.75,18.85 46.86,18.74 ; 54.59,20.21 55.42,19.39 56.68,19.39
  Top Layer w0.508: 59.94,13.2 59.8,13.35 58.52,13.35 ; 59.52,9.05 60.21,9.73 60.21,11.35 ; 56.69,13.67 57.14,13.22 58.42,13.22 ; 56.69,13.67 56.66,13.7 ; 56.69,13.67 56.69,13.96 ; 56.69,13.67 56.69,11.9 56.61,11.82 ; 56.65,9.78 56.68,9.81 56.68,11.77 ; 56.71,9.62 57.33,9 63.45,9 63.81,9.36 63.81,10.15 63.77,10.2
  Bottom Layer w0.254: 57.27,27.58 57.27,18.35 53.65,14.74
  Bottom Layer w0.305: 56.6,20.59 56.6,15.58 ; 55.67,14.57 56.6,15.51 56.6,15.58 ; 56.6,15.58 58.15,17.12 58.2,17.12 58.44,17.36 61,17.36 ; 56.6,15.58 56.28,15.25 ; 61,17.36 61.09,17.36 61.21,17.24 61.21,16.61 ; 61,17.36 62.73,17.42 62.96,17.19 62.96,16.61 ; 44.73,14.52 45.61,15.39 45.61,15.97
  Bottom Layer w0.508: 49.9,26.95 49.46,26.5 49.46,14.36
  Bottom Layer w1.27: 20.61,31.63 20.61,23.66 17.8,20.85 17.8,8.11 18.7,7.21 37.41,7.21 44.56,14.36 55.92,14.36 ; v1(55.31,13.07) 55.31,13.12 v1(55.82,13.63) 55.82,14.26 55.92,14.36 ; 55.92,14.38 55.92,14.36 ; 55.92,14.36 57.34,14.36
  vias: v1(19.63,34.09) v1(19.62,32.98) v1(19.63,31.63) v1(20.61,33.55) v1(21.52,34.06) v1(21.55,32.94) v1(45.65,16.08) v1(50.06,26.85) v1(55.05,14.28) v1(56.6,20.63) v1(57.01,14.31) v1(57.27,27.57) v1(61.24,16.45)
5V_IN: length 69.7
  Top Layer w0.5: v1(30.35,79.55) 32.55,79.55 U7.16 ; v1(28.32,79.6) 27.55,79.6 U8.16
  Top Layer w0.508: 12.78,85.82 13.97,85.82 13.98,85.83
  内层2 w0.5: v1(28.32,79.6) 30.3,79.6 v1(30.35,79.55)
  Bottom Layer w0.508: 7.7,52.53 7.7,53.88 8.09,54.27 14.97,54.27 15.01,54.23 ; 12.83,77.68 v1(12.83,85.71) ; 12.83,77.68 12.82,77.67 ; 12.83,77.68 12.83,58.18 15.63,55.39 ; 12.83,77.68 14.76,79.61 28.32,79.61 ; 30.3,79.66 30.3,80.16 29.69,80.77 27.77,80.77 26.68,79.68
  vias: v1(7.52,15.4) v1(7.7,52.63) v1(7.71,23.4) v1(7.91,14.63) v1(8.43,23.81) v1(8.55,10.49) v1(8.81,24.53) v1(9.42,9.62) v1(9.8,27.39) v1(9.93,10.51) v1(10.49,27.87) v1(10.66,9.64) v1(10.76,28.62) v1(15.86,54.52) v1(15.86,53.49) v1(17.27,53.39) v1(17.32,54.52) v1(18.03,45.64) v1(18.03,44.63) v1(18.04,43.61) v1(18.71,54.52) v1(18.73,53.35) v1(19.02,44.63) v1(19.04,43.61) v1(19.09,45.64)
GND: length 353.5
  Top Layer w0.254: RST.2 RST.1 ; RST.1 69.05,28.48 C32.2 69.05,28.77 SW3.2 SW3.1 68.62,34.14 SW3.3 ; RST.1 68.62,26.39 RST.3 66.37,25.66 ; v1(37.15,25.73) 37.15,28 ; 37.53,60.81 37.91,60.81 v1(38.89,59.82) ; 64.06,81.54 64.06,79.31 64.78,78.59 68.46,78.59 69.11,79.24 ; C13.1 5.08,53.5 5.08,56.44 4.9,56.62 4.4,56.62 R10.1 ; U8.8 22.79,85.4 v1(22.05,85.4) ; C47.1 50.48,56 49.8,55.31 49.22,55.31 48.89,54.98 48.89,54.03 ; 37.39,54.03 37.39,57.13 37.72,57.46 37.72,60.76 C52.1 ; C37.2 27.69,33.26 27.69,34.72 27.94,34.98 29.83,34.98 U1.107 ; 69.15,50.38 69.15,54.63 68.1,55.68 64.49,55.68 63.87,55.05 63.87,54.38 R14.1 ; X1.2 59.22,47 X1.4 ; CARD1.6 27.99,15.79 28.26,16.05 ; 59.48,34.19 59.48,35.57 59.42,35.62 ; 57.58,32.08 61.72,32.08 63.08,33.44 ; C18.2 66.29,25.58 ; 42.4,33.27 42.4,35.48 41.91,35.97 ; 27.74,33.07 27.74,31.68 27.7,31.65 ; 63.03,91.43 63.03,92.95 64.28,94.19 65.21,94.19 ; 51.44,41.98 57,41.98 57.02,41.96 C48.1 ; v1(18.54,81.76) 18.54,79.74 U9.8 ; 42.92,62.33 43.6,62.33 44.39,63.12 ; 42.92,62.33 42.89,62.33 ; 42.92,62.33 C46.1 ; 42.92,62.33 42.39,61.81 42.39,54.03 ; U1.94 24.93,41.48 C36.1 ; C41.1 36.7,63.23 H7.3 ; 50.56,56.65 51.88,56.65 v1(51.93,56.59)
  Top Layer w0.305: 29.42,46.94 29.34,47.01 28.09,47.01 26.14,48.96 26.09,48.96 ; 66.1,25.39 66.37,25.66 ; 69.18,41.46 68.89,41.46 68.3,42.06 67.12,42.06 ; 52.75,88.57 52.75,90.52 52,91.27 50.52,91.27 ; U1.120 37.39,28.2 37.15,27.96 C50.1 ; 62.9,33.53 65.15,33.53 65.65,34.03 ; v1(57.43,28.7) 57.31,28.83 55.97,28.83 ; 66.12,24.61 66.12,25.37 ; 69.24,37.01 69.24,37.01 69.24,41.36 ; C49.1 42.39,31.26 U1.130 ; 57.43,28.75 58.06,28.13 58.06,26.04 58.15,25.94 ; 67.09,34.18 67.04,34.14 65.6,34.14 ; 5.72,32.75 5.72,31.47 5.72,31.47 ; 57.98,19.29 57.96,19.28 57.96,17.7
  Top Layer w0.35: C48.1 57.47,41.9 58.04,42.47 65.15,42.47 64.11,41.43 C34.2 ; v1(57.43,49.84) 56.73,49.14 56.26,49.14 56.2,49.07 C40.1 54.01,49.48 51.44,49.48 ; X1.4 61.3,45.3 62.61,43.99 66.17,43.99 ; C33.2 64.54,39.06 65.65,40.18 65.65,41.07 66.55,41.96 ; 67.18,43.49 67.29,43.49 69.15,45.35 69.15,50.38 ; C16.2 65.22,45.58 66.67,44.12 ; 60.39,43.36 66.17,43.36
  Top Layer w0.4: 66.2,42.44 66.17,42.47 65.15,42.47
  Top Layer w0.5: C30.1 42.86,18.11 X2.4 ; U7.8 38.55,86.67 v1(35.94,86.67) ; X2.4 41.8,18.26 C31.2 ; X2.4 42.71,18.42 43.9,19.61 43.91,19.61 44.41,20.11 X2.2 ; P3.3 21.78,42.41 C36.1 ; v1(26.8,83.74) v1(28.96,81.59)
  Top Layer w0.508: 7.72,20.07 7.68,20.03 ; 7.68,20.03 7.12,19.47 ; 7.68,20.03 7.68,20.02 ; 7.68,20.03 7.68,21.53 7.38,21.83 ; 7.39,9 7.37,9.02 5.74,9.02 ; 7.12,19.47 7.1,19.45 ; 7.12,19.47 7.11,19.49 5.95,19.49 5.91,19.52 ; 7.12,19.47 7.47,19.13 7.47,17.07 7.01,16.61 6.55,16.61 ; 69.32,81.32 69.25,81.39 69.25,85.35 ; 38.13,12.01 38.15,12.03 38.15,13.11 ; 69.3,88.78 69.19,88.89 69.19,93.06 ; 27.91,12.3 28.01,12.2 28.01,11.14 27.65,10.78 24.38,10.78 23.59,11.57 ; 49.96,10.7 49.96,13.08 ; 17.93,13.82 18.01,13.74 19.59,13.74 ; 23.4,2.09 23.36,2.05 22.14,2.05 ; v1(69.11,79.26) 69.11,80.95 69.18,81.03 ; 58.67,10.16 58.61,10.22 58.61,11.99 ; 17.91,13.78 17.9,13.79 16.03,13.79 14.74,12.5 14.74,11 ; 26.36,49.3 25.5,48.44 25.5,48.43 ; 24.72,12.52 23.81,11.61 23.48,11.61 ; 53.71,13.19 53.83,13.07 53.83,11.89 ; 58.95,91.19 58.99,91.24 60.29,91.24 ; 22.23,11.69 23.31,11.69 23.35,11.74 ; 1.62,21.22 2.44,20.39 2.44,19.51 ; 37.48,2.09 39.19,2.09 39.21,2.12 ; v1(11.24,16.37) 11.16,16.37 10.81,16.72 10.8,16.72 10.56,16.96 10.56,16.97 9.96,17.57 ; 47.92,12.93 48.93,11.92 48.93,11.62 ; 69.08,88.39 69.23,88.54 ; 69.08,88.39 69.08,85.82 69.21,85.69 ; 69.08,88.39 68.32,87.62 ; 69.08,88.39 69.08,88.64 ; 55.18,11.74 55.07,11.85 53.87,11.85 ; 65.21,86.77 67.97,86.77 69.05,85.69 ; 69.22,93.28 68.19,94.31 65.52,94.31 ; 4.18,52.69 3.11,51.62 3.11,51.17 ; 6.08,16.56 6.04,16.56 5.71,16.89 5.71,17.61 5.72,17.63 ; 55.19,11.74 55.19,9.93 55.15,9.89 ; 46.21,9.6 46.2,9.61 43.15,9.61 ; 58.55,12.06 59.74,12.06 60.07,12.4 ; 51.9,10.77 51.81,10.86 51.81,12.4 ; 48.9,91.1 49.1,91.3 50.41,91.3 ; 42.7,16.1 42.7,14.78 42.75,14.73 ; 48.54,11.46 49.94,11.46 49.95,11.45
  内层2 w0.5: v1(26.8,83.74) 26.03,84.51 23.26,84.51 ; 18.54,72.52 19.68,73.67 19.68,80.87 23.26,84.45 23.26,84.51 ; 18.54,72.52 18.54,74.35 ; 18.54,72.52 18.54,69.39 H5.9 ; v1(28.96,81.59) 29.84,81.59 34.92,86.67 v1(35.94,86.67) 46.23,76.38 H3.9 ; v1(18.54,81.76) 18.54,81.89 21.16,84.51 ; 21.16,84.51 23.26,84.51 ; 21.16,84.51 v1(22.05,85.4)
  vias: v1(2.99,51.16) v1(4.63,62.2) v1(5.48,62.2) v1(5.72,32.89) v1(6.31,61.89) v1(6.31,61.05) v1(6.65,44.6) v1(7.46,61.06) v1(7.39,30.2) v1(7.48,61.85) v1(7.48,21.44) v1(7.56,8.05) v1(7.56,6.85) v1(8.05,22.12) v1(8.18,29.61) v1(8.49,8.05) v1(8.5,6.86) v1(8.58,28.71) v1(8.68,22.74) v1(9.65,53.26) v1(9.65,52.25) v1(10.6,53.26) v1(10.6,52.32) v1(13.18,34.63) v1(13.2,33.71) v1(13.59,44.31) v1(13.59,43.37) v1(14.16,33.67) v1(14.15,32.9) v1(14.83,4.88) v1(15.15,33.69) v1(15.14,32.87) v1(18.26,25.9) v1(19.47,13.8) v1(22.13,2.07) v1(22.23,11.68) v1(23.83,26.34) v1(25.1,88.07) v1(26.15,24) v1(26.37,49.25) v1(26.41,88.61) v1(27.73,89.83) v1(27.7,31.57) v1(29.09,26.31) v1(30.12,76.48) v1(30.29,88.89) v1(30.95,4.46) v1(31.26,19.14) v1(31.64,27.98) v1(31.59,24.57) v1(35.13,20.47) v1(37.46,1.99) v1(38.13,13.16) v1(40.07,89.27) v1(41.11,91.22) v1(41.86,35.97) v1(42.8,14.7) v1(43.13,9.62) v1(44.37,63.08) v1(46.9,77.72) v1(47.02,16.23) v1(48.86,91.15) v1(49.97,10.66) v1(50.01,77.58) v1(50.03,71.32) v1(50.19,23.15) v1(50.18,21.1) v1(51.14,22.24) v1(51.87,10.74) v1(52,23.7) v1(52.11,21.28) v1(52.72,22.96) v1(52.85,77.54) v1(52.82,71.27) v1(52.99,24) v1(53.88,11.8) v1(55.18,71.32) v1(56.45,76.65) v1(57.34,80.8) v1(57.69,71.32) v1(57.95,17.73) v1(58.32,77.15) v1(58.64,10.15) v1(59.44,34.14) v1(60.13,91.25) v1(60.19,80.84) v1(65.65,34.12) v1(66.14,24.49) v1(66.72,43.68) v1(66.72,42.54) v1(68.27,87.55)
VBAT: length 15
  Top Layer w0.508: v1(65.86,35.22) 65.86,35.21 63.15,35.21
  Bottom Layer w0.508: 65.82,35.25 66.56,35.25 67.34,36.03 67.34,41.56 67.88,42.1 67.88,45.52 67.37,46.03
ANT: length 7.7
  Top Layer w0.254: 48.71,20.28 48.46,20.03 48.46,15.01 C23.2 46.42,14.53 L5.2
BOOT: length 38.5
  Top Layer w0.18: v1(58.02,15.37) 58.05,15.33 58.05,15.29 54.05,15.29 50.42,18.91 50.42,19.59 50.43,19.59
  Top Layer w0.254: C32.1 67.5,30.33 SW3.4 64.94,30.74 R26.1
  Top Layer w0.305: 64.82,30.97 64.82,32.24
  内层2 w0.305: 64.78,32.29 64.9,32.17 v1(64.9,18.61)
  Bottom Layer w0.305: 64.92,18.6 64.92,17.18 63.06,15.33 58.06,15.33 v1(58.02,15.37)
  vias: v1(64.82,32.22)
BOOT0: length 40.8
  Top Layer w0.254: R14.2 67.02,54.28 67.1,54.2
  Top Layer w0.305: v1(65.23,52.63) 65.22,52.64 65.22,54.43 ; 46.37,37.14 46.37,32.53 46.43,32.47 46.43,32.43
  内层2 w0.305: 65.37,52.65 62.84,52.65 56.34,46.14 48.59,46.14 43.74,41.3 43.74,38.44 45.02,37.16 v1(46.4,37.16)
CH340_RX: length 11
  Top Layer w0.254: H1.2 9.91,22.53 8.2,20.83 8.2,16.1 R19.2
CH340_TX: length 13.9
  Top Layer w0.254: R21.2 9.79,16.04 9.05,16.04 8.79,16.29 8.79,20.53 9.65,21.39 14.19,21.39 H2.2
EN: length 15.5
  Top Layer w0.254: R2.1 6.09,81.33 R5.2 6.1,80.57 v1(5.59,80.06) ; 4.32,72.47 v1(4.32,70.71)
  内层2 w0.254: v1(5.59,80.06) 3.43,77.9 3.43,71.6 v1(4.32,70.71)
FB1: length 7.9
  Top Layer w0.254: U3.14 9.74,54.33 9.74,54.83 9.52,55.04 5.91,55.04
  Top Layer w0.5: R8.1 R10.2 5.83,54.97 C8.1
FB4: length 10.4
  Top Layer w0.254: R1.1 R6.2 12.06,68.39 11.18,69.27 9.91,69.27 9.65,69.52 9.65,71.55 8.74,72.47 U2.4
OSC32_IN: length 10.8
  Top Layer w0.254: 51.44,37.98 58.64,37.98 X3.2 61.6,38.91 C33.1
OSC32_OUT: length 11.6
  Top Layer w0.254: 51.44,38.48 56.59,38.48 X3.1 61.73,41.46 C34.1
OSC_IN: length 9.4
  Top Layer w0.254: 51.44,45.48 58.54,45.48 X1.3 58.99,45.03 C17.2
OSC_OUT: length 13.8
  Top Layer w0.254: 51.44,45.98 51.48,46.03 57.3,46.03 57.48,46.2 57.48,47.62 57.91,48.06 59.86,48.06 X1.1 63.1,47 C16.1
PA0_UART4_TX: length 20.4
  Top Layer w0.254: 51.44,50.98 53.09,50.98 65.79,63.68 H6.1
PA1_UART4_RX: length 18
  Top Layer w0.254: 51.44,51.48 52.39,51.48 64.01,63.1 H6.2
PA2_TIM2_CH3: length 81.5
  Top Layer w0.254: v1(41.78,72.31) 41.78,78.28 44.2,80.7 44.2,92 40.89,95.3 38.57,95.3 38.51,95.36 19.11,95.36 18.54,94.79 18.54,93.02 17.27,91.75 ; v1(55.5,62.41) 55.5,56.04 51.44,51.98
  内层2 w0.254: v1(55.5,62.41) 47.24,70.66 43.43,70.66 v1(41.78,72.31)
PA7_ADC1_INP7: length 44.1
  Top Layer w0.254: 64.01,74.35 64.01,73.58 46.47,56.05 46.47,54.11 46.39,54.03 ; 56.23,88.34 56.23,83.38 63.85,75.76 63.85,75.04
PA9_USART1_TX: length 26.6
  Top Layer w0.254: v1(26.03,38.28) 27.94,38.28 28.24,37.98 U1.101 ; v1(25.4,35.23) 24.77,34.6 24.77,31.93 21.59,28.75 14.99,28.75 12.45,26.21 H1.3
  内层2 w0.254: v1(25.4,35.23) 25.4,37.64 v1(26.03,38.28)
PA10_USART1_RX: length 23.7
  Top Layer w0.254: v1(26.03,31.55) 25.4,31.55 21.84,27.99 16.13,27.99 15.32,27.18 H2.3 ; v1(27.56,37.64) 27.72,37.48 U1.102
  内层2 w0.254: v1(26.03,31.55) 26.03,36.12 v1(27.56,37.64)
PA13_SWD_TMS: length 19
  Top Layer w0.254: U1.105 26.91,35.98 v1(26.67,35.74)
  内层2 w0.254: P3.4 24,44.37 24.51,43.87 24.51,39.42 25.07,38.86 27.99,38.86 28.45,38.41 28.45,37.52 v1(26.67,35.74)
PA14_SWD_CLK: length 19.5
  Top Layer w0.254: U1.109 31.89,29.91 v1(31.88,29.9)
  内层2 w0.254: P3.2 24.82,35.69 24.82,34.99 25.27,34.53 25.27,31.17 26.54,29.9 v1(31.88,29.9)
PB0_ADC1_INP9: length 39.6
  Top Layer w0.254: 54.72,88.41 54.72,77.25 56.2,75.77 56.2,74.51 ; 56.39,74.35 56.39,69.14 44.89,57.64 44.89,54.03
PB1_ADC1_INP5: length 38.2
  Top Layer w0.254: 54.2,88.28 54.2,75.13 53.71,74.63 ; H3.6 54.04,74.16 54.04,68.06 44.45,58.47 44.45,54.09 44.39,54.03
PB2_LSPI_CK: length 20.7
  Top Layer w0.18: 62.04,12.67 62.54,12.67 62.58,12.7 63.43,12.7 64.65,13.91 64.65,15.11 ; 59.12,22.91 55.25,22.91 55.05,23.1 54.87,23.1 54.86,23.11 ; 59.36,22.77 59.39,22.73 59.97,22.73 60.18,22.52 60.18,19 60.19,18.99 v1(60.19,16.44)
  内层2 w0.18: 64.72,15.22 61.41,15.22 v1(60.19,16.44)
  vias: v1(64.64,15.11)
PB3_LSPI_DI: length 19
  Top Layer w0.18: 54.57,23.46 60.26,23.46 60.97,22.75 ; 63.44,14.93 63.44,15.5 63.2,15.74 62.46,15.74 62.11,16.09 62.11,20.53 61.93,20.71 61.93,22.56 61.69,22.79 60.94,22.79 ; 63.43,14.92 63.43,14.88 63.31,14.77 62.48,14.77 62.27,14.55 62.27,13.81 61.86,13.81
PB3_SPI3_SCK: length 36.6
  Top Layer w0.305: v1(43.94,35.87) 43.89,35.81 U1.133
  内层2 w0.254: v1(43.94,35.87) 46.1,35.87 66.93,15.04 P2.6
PB4_LSPI_CS: length 24.4
  Top Layer w0.18: 54.59,23.79 54.61,23.81 55.26,23.81 55.47,24.02 59.85,24.02 ; 63.82,12.12 65.11,12.12 v1(66.11,13.12)
  Top Layer w0.305: 62.21,12.13 62.23,12.14 63.61,12.14 ; 63.71,12.14 63.61,12.14 ; 63.61,12.14 63.61,11.96
  Bottom Layer w0.18: 66.15,13.22 66.15,19.91 61.98,24.09 v1(59.95,24.09)
PB5_LSPI_DO: length 19.9
  Top Layer w0.18: 62.77,22.63 62.94,22.8 63.14,22.8 63.92,22.01 63.92,14.81 62.26,13.14 ; 54.7,24.51 56.21,24.51 56.35,24.65 60.76,24.65 60.77,24.65 60.85,24.65 62.5,23 62.56,23 62.7,22.86
PB5_SPI3_MOSI: length 35.3
  Top Layer w0.305: U1.135 44.89,34.4 v1(44.96,34.47)
  内层2 w0.254: v1(44.96,34.47) 45.72,33.71 45.72,32.56 48.57,29.72 50.98,29.72 68.2,12.5 P2.5
PB11_TIM2_CH4: length 55.7
  Top Layer w0.254: 32.89,54.03 32.89,54.03 32.89,56.31 v1(33.02,56.44) ; v1(14.35,64.95) v1(20.95,64.95)
  内层2 w0.254: v1(20.95,64.95) 20.95,64.57 24.98,60.54 28.92,60.54 v1(33.02,56.44) ; v1(14.35,64.95) 14.35,65.33 13.97,65.71 13.97,70.16 9.65,74.47 9.65,86.16 14.73,91.24 14.73,91.75
PB12_HSPI_CK: length 16.8
  Top Layer w0.17: U4.48 52.18,28 51.41,28.78 44.23,28.78 43.69,29.32 42.23,29.32 40.39,31.16 U1.126
PB12_UART5_RX: length 16.2
  Top Layer w0.254: U1.73 29.08,52.74 29.08,61.27 29.97,62.15 33.53,62.15 34.16,62.79 H7.2
PB13_HSPI_INT: length 15.5
  Top Layer w0.17: v1(51.5,27.8) 51.83,27.47 U4.49 ; U1.127 40.89,32.43 40.89,31.55 41.01,31.43 41.01,31.42 41.23,31.19 41.25,31.19 v1(42.55,29.9)
  内层2 w0.17: v1(42.55,29.9) 43.94,29.9 44.7,29.13 50.17,29.13 v1(51.5,27.8)
PB13_UART5_TX: length 16.1
  Top Layer w0.254: H7.1 31.5,63.55 29.21,63.55 28.45,62.79 28.45,51.74 28.71,51.48 U1.74
PB14_DIR: length 38.6
  Top Layer w0.254: H5.3 27.94,63.55 27.94,51.74 28.7,50.98 U1.75 ; U8.11 24.26,79.39 v1(24.26,77.27)
  内层2 w0.254: H5.3 33.65,69.9 29.97,73.58 29.97,75.62 28.32,77.27 v1(24.26,77.27)
PB14_DIR_CONV: length 16.4
  Top Layer w0.254: U8.12 24.82,81.51 v1(25.4,82.09)
  内层2 w0.254: 32.51,91.75 32.51,87.64 26.96,82.09 v1(25.4,82.09)
PB14_HSPI_CS: length 16.2
  Top Layer w0.17: U4.50 51.47,25.54 51.47,27.07 50.29,28.25 44.2,28.25 43.43,29.01 41.92,29.01 39.89,31.04 U1.125
PB15_DIR: length 34.3
  Top Layer w0.254: U8.14 26.16,79.43 v1(26.16,76.51) ; H5.4 27.43,65.58 27.43,51.74 28.69,50.48 U1.76
  内层2 w0.254: v1(26.16,76.51) 27.56,75.11 27.56,73.2 31.11,69.65 H5.4
PB15_DIR_CONV: length 13.9
  Top Layer w0.254: U8.15 26.75,79.5 26.75,82.7 v1(26.77,82.73)
  内层2 w0.254: 29.97,91.75 29.35,91.12 29.35,86.72 29.73,86.34 29.73,85.85 26.77,82.89 v1(26.77,82.73)
PB15_HSPI_DI: length 16.7
  Top Layer w0.17: U4.51 51.14,26.64 50.04,27.74 42.04,27.74 38.89,30.88 U1.123
PB16_HSPI_DO: length 15
  Top Layer w0.17: U4.55 49.73,26.31 49.13,26.91 v1(43.75,26.91) ; U1.124 39.39,31.02 42.04,28.37 v1(43.18,28.37)
  内层2 w0.17: v1(43.75,26.91) 43.18,27.48 v1(43.18,28.37)
PB19_TX0: length 41
  Top Layer w0.18: U4.9 47.88,22.05 47.27,22.66 ; v1(45.87,22.66) 47.27,22.66 ; 47.27,22.66 47.28,22.66
  内层2 w0.254: v1(45.87,22.66) 36.47,22.66 36.25,22.44 36.18,22.52 34.13,20.46 31.94,20.46 30.85,21.56 27.65,21.56 27.35,21.85 20.78,21.85 16.62,17.69 13.75,17.69 12.7,18.73 12.7,19.73
PB20_RX0: length 34.8
  Top Layer w0.18: v1(44.01,23.27) 47.14,23.27 48.01,22.4 48.49,22.4
  内层2 w0.254: 15.37,20.18 15.84,20.18 16.28,20.62 16.44,20.62 19.11,23.29 43.98,23.29 v1(44.01,23.27)
PC0_ADC1_INP10: length 53.2
  Top Layer w0.254: 56.73,88.34 56.73,85.59 66.31,76.01 66.31,74.93 ; 66.55,74.35 56.64,64.44 v1(56.64,56.95) ; 51.44,46.98 v1(54.1,46.98)
  内层2 w0.254: v1(54.1,46.98) 55.18,46.98 55.44,47.24 55.44,55.24 56.64,56.44 v1(56.64,56.95)
PC4_ADC1_INP4: length 42.9
  Top Layer w0.254: 61.54,74.61 61.54,75.27 55.71,81.1 55.71,88.31 ; 45.89,54.03 45.89,56.36 61.47,71.93 H3.3
PC5_ADC1_INP8: length 41
  Top Layer w0.254: 58.94,74.69 58.94,75.29 55.25,78.98 55.25,88.2 ; 58.93,74.35 58.93,70.41 45.39,56.87 45.39,54.03
PC6_TIM3_CH1: length 62.5
  Top Layer w0.254: v1(26.03,40.44) 26.08,40.48 U1.96
  内层2 w0.254: v1(26.03,40.44) 26.03,48.44 24.64,49.84 24.64,59.11 17.13,66.61 17.13,88.43 18.54,89.84 18.54,93.14 17.4,94.29 17.27,94.29
PC7_TIM3_CH2: length 69.6
  Top Layer w0.254: U1.97 26.72,39.98 26.29,39.55 v1(25.4,39.55)
  内层2 w0.254: v1(25.4,39.55) 25.4,44.76 23.24,46.91 23.24,58.22 14.73,66.73 14.73,73.71 13.72,74.73 11.3,74.73 10.67,75.36 10.67,84.89 16,90.22 16,93.02 14.73,94.29
PC8_SDMMC1_D0: length 37
  Top Layer w0.254: 26.89,12.72 27.04,12.87 R29.2 27.04,20.77 27.22,20.95 28.14,20.95 28.32,21.12 28.32,22.29 28.14,22.47 27.22,22.47 27.04,22.65 27.04,23.81 27.22,23.99 28.14,23.99 28.32,24.17 28.32,25.34 28.14,25.52 27.22,25.52 27.04,25.7 27.04,26.33 31.24,30.53 31.24,33.24 33.65,35.65 33.65,38.41 32.58,39.48 U1.98
PC9_SDMMC1_D1: length 37
  Top Layer w0.254: U1.99 31.43,38.98 31.62,38.79 31.62,34.47 30.61,33.45 30.61,31.67 24.2,25.27 24.2,24.64 24.02,24.46 22.91,24.46 22.73,24.28 22.73,23.11 22.91,22.93 24.02,22.93 24.2,22.75 24.2,21.59 24.02,21.41 22.91,21.41 22.73,21.23 22.73,20.06 22.91,19.89 24.02,19.89 24.2,19.71 24.2,17.76 24.89,17.07 25.4,17.07 25.77,16.7 25.77,15.8 25.79,15.78 25.79,12.72
PC10_SDMMC1_D2: length 37
  Top Layer w0.254: U1.111 32.89,28.96 32.71,28.78 29.99,28.78 29.81,28.6 29.81,27.43 29.99,27.25 32.71,27.25 32.89,27.07 32.89,25.57 32.63,25.31 30.02,25.31 29.84,25.13 29.84,23.97 30.02,23.79 32.71,23.79 32.89,23.61 32.89,22.44 32.71,22.26 30.02,22.26 29.84,22.09 29.84,17.87 30.02,17.69 32.71,17.69 32.89,17.51 32.89,17.08 R31.2 33.41,12.8 CARD1.1
PC11_SDMMC1_D3: length 36.1
  Top Layer w0.254: U1.112 33.39,30.03 33.71,29.72 33.71,21.37 33.53,21.19 32.56,21.19 32.39,21.01 32.39,19.86 32.56,19.68 35.87,19.68 36.2,19.36 36.2,18.77 36.02,18.59 33.96,18.59 33.71,18.34 33.71,17.82 33.96,17.56 36.59,17.56 36.69,17.46 R27.2 36.69,11.65 36.44,11.4 32.65,11.4 32.39,11.65 32.39,12.72
PC12_SDMMC1_CK: length 36.4
  Top Layer w0.254: U1.113 33.89,31.48 34.54,30.82 34.54,22.13 39.62,17.05 39.62,10.59 39.37,10.34 30.48,10.34 29.09,11.73 CARD1.5
PD2_SDMMC1_CMD: length 36.9
  Top Layer w0.254: U1.116 35.39,23.08 v1(36.58,21.9) ; v1(32.64,14.53) 31.49,14.53 R28.2 31.29,14.41 31.29,12.72
  内层2 w0.254: v1(36.58,21.9) 37.22,21.25 37.47,21.25 38.3,22.08 38.55,22.08 39.38,21.25 39.38,21 38.55,20.17 38.55,19.92 39.37,19.1 39.63,19.1 40.45,19.92 40.71,19.92 41.53,19.1 41.53,18.84 40.71,18.02 40.71,17.77 41.02,17.45 41.02,15.93 32.87,15.93 32.64,15.69 v1(32.64,14.53)
PD8_DIR: length 49.4
  Top Layer w0.254: U9.3 15.29,79.74 15.29,80.9 15.11,81.08 13.46,81.08 13.21,80.82 13.21,74.22 14.48,72.95 24.38,72.95 28.07,69.27 H5.5 26.92,67.62 26.92,51.61 28.56,49.98 U1.77
PD8_DIR_CONV: length 26.2
  Top Layer w0.254: U9.2 14.63,77.14 14.88,76.89 19.94,76.89 20.6,77.55 v1(20.6,85.4)
  内层2 w0.254: v1(20.6,85.4) 26.95,91.75 U10.10
PD9_DIR: length 50.3
  Top Layer w0.254: U1.78 29.81,49.45 28.45,49.45 26.42,51.49 26.42,68.89 H5.6 22.99,72.31 14.1,72.31 12.7,73.71 12.7,81.08 13.21,81.59 15.75,81.59 16.64,80.7 16.64,79.78 U9.5
PD9_DIR_CONV: length 22.2
  Top Layer w0.254: v1(20.02,86.28) 20.02,77.85 19.68,77.52 16.19,77.52 15.93,77.78 U9.4
  内层2 w0.254: 24.89,91.75 24.89,91.16 v1(20.02,86.28)
PD10_DIR: length 52.5
  Top Layer w0.254: U9.7 17.88,80.6 16.38,82.09 12.95,82.09 12.19,81.33 12.19,73.2 13.59,71.81 20.95,71.81 H5.7 25.91,66.85 25.91,51.23 28.16,48.98 U1.79
PD10_DIR_CONV: length 18.3
  Top Layer w0.254: U9.6 17.23,78.32 17.4,78.16 19.18,78.16 19.43,78.41 v1(19.43,87.17)
  内层2 w0.254: v1(19.43,87.17) 22.35,90.09 22.35,91.75
PD11_DIR: length 54.7
  Top Layer w0.254: U9.9 18.53,83.86 17.4,82.73 12.7,82.73 11.68,81.71 11.68,72.95 13.59,71.04 19.18,71.04 H5.8 25.27,64.95 25.27,51.23 28.02,48.48 U1.80
PD11_DIR_CONV: length 6.8
  Top Layer w0.254: U9.10 v1(17.88,87.27)
  内层2 w0.254: v1(17.88,87.27) 19.81,89.21 U10.16
PD12_TIM4_CH1: length 48.9
  Top Layer w0.254: v1(31.88,48.44) 31.42,47.98 U1.81 ; U7.11 34.97,84.08 35.81,83.24 35.81,79.17 34.16,77.52 29.59,77.52 28.7,76.63 H4.5 28.7,72.44 v1(27.3,71.04)
  内层2 w0.254: v1(27.3,71.04) 27.3,68.76 28.07,68 28.07,62.41 33.6,56.87 33.6,50.29 31.88,48.57 v1(31.88,48.44)
PD12_TIM4_CH1_CONV: length 14
  Top Layer w0.254: U7.12 32.95,83.43 28.83,87.55 28.83,92.89 27.43,94.29
PD13_TIM4_CH2: length 49.3
  Top Layer w0.254: v1(32.96,47.52) 32.92,47.48 U1.82 ; U7.14 34.76,82.13 35.31,81.59 35.31,80.06 33.91,78.66 29.46,78.66 27.94,77.14 27.94,76.12 H4.6
  内层2 w0.254: H4.6 26.16,73.46 29.84,69.77 29.84,62.15 34.42,57.58 34.42,48.98 v1(32.96,47.52)
PD13_TIM4_CH2_CONV: length 17.5
  Top Layer w0.254: 24.89,94.29 25.02,94.29 26.29,93.02 26.29,89.97 28.07,88.19 28.07,85.65 32.23,81.48 U7.15
PD14_TIM4_CH3: length 49
  Top Layer w0.254: U8.3 26.12,84.47 23.88,82.22 22.61,82.22 21.84,81.46 21.84,76.12 H4.7 ; v1(24.51,64.31) 23.75,63.55 23.75,47.51 25.28,45.98 U1.85
  内层2 w0.254: H4.7 23.75,74.35 24.89,73.2 24.89,64.69 v1(24.51,64.31)
PD14_TIM4_CH3_CONV: length 10.6
  Top Layer w0.254: U8.2 26.77,87.33 23.62,90.48 23.62,93.02 22.35,94.29
PD15_TIM4_CH4: length 49.1
  Top Layer w0.254: H4.8 21.08,81.84 22.1,82.86 23.75,82.86 24.82,83.93 U8.5 ; U1.86 24.77,45.48 22.99,47.27 22.99,50.72 22.61,51.11 v1(22.61,65.08)
  内层2 w0.254: v1(22.61,65.08) 22.23,65.46 22.23,73.2 H4.8
PD15_TIM4_CH4_CONV: length 11.2
  Top Layer w0.254: U8.4 25.47,86.72 21.08,91.11 21.08,93.02 19.81,94.29
PE2_EXIT2_KEY1: length 20.6
  Top Layer w0.305: 51.81,34.45 53.65,34.45 54.71,33.39 61,33.39 62.11,34.5 62.11,37.62 62.33,37.84 64.32,37.84 66.8,40.32 66.8,40.75
PE3_EXIT3_KEY2: length 63.9
  Top Layer w0.254: 51.47,34.95 49.68,34.95 45.68,38.96 45.68,46.87 ; 65.2,85.01 65.61,84.6 v1(65.61,80.12)
  Top Layer w0.508: 66.91,84.91 65.67,84.91 65.38,85.19
  内层2 w0.254: 65.44,80.22 65.44,70.16 56.86,61.57 56.86,58.33 46.85,48.33 46.85,47.32 46.45,46.92 45.82,46.92 v1(45.78,46.96)
PE4_EXIT4_KEY3: length 69.3
  Top Layer w0.254: 65.47,92.68 64.45,91.66 v1(64.45,82.93) ; 50.98,35.49 50.17,35.49 46.52,39.13 46.52,47.38 46.24,47.66
  Top Layer w0.508: 65.37,92.67 65.42,92.62 65.59,92.45 67.07,92.45
  内层2 w0.254: v1(46.2,47.75) 46.2,48.78 56,58.58 56,61.65 62.68,68.33 62.68,75.76 64.45,77.54 v1(64.45,82.93)
PE9_TIM1_CH1: length 32.1
  Top Layer w0.254: 37.89,54.03 37.89,57.12 v1(38.55,57.78) ; U7.3 38.65,82.13 38.35,81.84 38.35,78.28 38.86,77.78 H4.1
  内层2 w0.254: H4.1 38.86,73.58 41.4,71.04 41.4,60.63 v1(38.55,57.78)
PE9_TIM1_CH1_CONV: length 18.5
  Top Layer w0.254: U7.2 41.55,81.48 43.05,82.98 43.05,90.6 39.37,94.29 37.59,94.29
PE10_DIR: length 43.7
  Top Layer w0.254: v1(23.52,83.62) U8.7 ; v1(36.6,57.84) 36.39,57.63 36.39,54.03
  内层2 w0.254: v1(23.52,83.62) 23.19,83.28 23.19,81.26 23.62,80.82 30.1,80.82 35.05,75.87 35.05,72.95 H5.1 38.61,69.14 38.61,67.11 39.75,65.96 39.75,62.15 36.6,59 v1(36.6,57.84)
PE10_DIR_CONV: length 19.8
  Top Layer w0.254: v1(29.15,86.09) 29.27,86.09 v1(31.11,84.25) ; U8.6 v1(24.17,87.05)
  内层2 w0.254: U10.2 37.59,90.73 v1(31.11,84.25) ; v1(24.17,87.05) 28.19,87.05 v1(29.15,86.09)
PE11_TIM1_CH2: length 34.1
  Top Layer w0.254: v1(37.46,67.49) 37.46,72.8 36.32,73.94 H4.2 36.32,74.85 37.85,76.38 37.85,82.98 38.35,83.49 39.77,83.49 U7.5 ; 35.89,54.03 v1(35.89,58.67)
  内层2 w0.254: v1(37.46,67.49) 37.46,66.35 38.86,64.95 38.86,62.59 35.94,59.67 35.94,58.73 v1(35.89,58.67)
PE11_TIM1_CH2_CONV: length 17.5
  Top Layer w0.254: U7.4 41.2,82.78 42.29,83.87 42.29,89.08 38.35,93.02 36.32,93.02 35.05,94.29
PE12_DIR: length 37.1
  Top Layer w0.254: v1(35.27,57.99) 35.39,57.88 35.39,54.03 ; v1(22.86,78.03) 22.86,79.46 U8.9
  内层2 w0.254: v1(35.27,57.99) 35.27,60.47 38.1,63.3 38.1,64.69 36.45,66.35 36.45,69.01 H5.2 36.2,69.9 32.51,73.58 32.51,75.36 29.84,78.03 v1(22.86,78.03)
PE12_DIR_CONV: length 19
  Top Layer w0.254: v1(24,81.46) 23.52,80.98 U8.10
  内层2 w0.254: v1(24,81.46) 27.3,81.46 35.05,89.21 U10.4
PE13_TIM1_CH3: length 35.8
  Top Layer w0.254: U7.7 39.8,84.76 37.97,84.76 37.08,83.87 37.08,77.39 34.04,74.35 H4.3 33.72,74.28 v1(33.72,71.23) ; v1(34.42,59.23) 34.42,58.03 34.89,57.55 34.89,54.03
  内层2 w0.254: v1(33.72,71.23) 34.92,70.03 34.92,68.12 35.43,67.62 35.43,62.79 34.42,61.77 v1(34.42,59.23)
PE13_TIM1_CH3_CONV: length 16.8
  Top Layer w0.254: U7.6 39.87,84.13 41.02,84.13 41.66,84.76 41.66,85.4 36.83,90.22 34.54,90.22 33.86,90.91 33.86,92.94 32.51,94.29
PE14_TIM1_CH4: length 39.1
  Top Layer w0.254: v1(33.65,59.23) 33.27,58.85 33.27,57.96 34.04,57.2 34.04,55.34 34.31,55.06 34.31,54.11 34.39,54.03 ; v1(31.24,70.92) H4.4 31.24,76.25 31.75,76.76 34.8,76.76 36.45,78.41 36.45,84.51 35.44,85.51 33.96,85.51 U7.9
  内层2 w0.254: v1(31.24,70.92) 32.39,69.77 32.39,68.5 33.02,67.87 33.02,62.28 33.65,61.65 v1(33.65,59.23)
PE14_TIM1_CH4_CONV: length 11.8
  Top Layer w0.254: 29.97,94.29 31.24,93.02 31.24,86.28 32.79,84.73 U7.10
PF11_ADC1_INP2: length 38.1
  Top Layer w0.254: H3.7 51.31,67.11 43.39,59.19 43.39,54.03 ; 53.71,88.44 53.71,81.87 51.3,79.46 51.3,74.89
PF12_ADC1_INP6: length 38.7
  Top Layer w0.254: 48.7,74.4 48.7,80.25 53.26,84.82 53.26,88.44 ; 42.89,54.03 42.89,60.47 48.77,66.35 48.77,74.35
PG13_SPI3_CS: length 45.7
  Top Layer w0.305: v1(40.89,34.34) 41.39,33.85 U1.128
  内层2 w0.254: P2.2 66.93,6.4 66.93,8.05 65.4,9.58 60.71,9.58 v1(45.08,25.2)
  Bottom Layer w0.254: v1(45.08,25.2) 45.08,29.9 40.89,34.09 v1(40.89,34.34)
PG14_DC: length 44.8
  Top Layer w0.305: U1.129 41.89,34.23 v1(40.88,35.25)
  内层2 w0.254: v1(46.48,25.71) 61.47,10.72 65.4,10.72 68.45,7.67 P2.3
  Bottom Layer w0.254: v1(46.48,25.71) 46.48,29.64 40.88,35.25 v1(40.88,35.25)
PG15_RES: length 39.9
  Top Layer w0.305: U1.132 43.39,34.55 v1(43.27,34.67)
  内层2 w0.254: v1(48.01,26.21) 62.23,11.99 66.42,11.99 P2.4
  Bottom Layer w0.254: v1(43.27,34.67) 48.01,29.93 v1(48.01,26.21)
RESET: length 114.2
  Top Layer w0.18: 43.53,22.1 45.63,22.1 45.64,22.09 46.09,22.09 46.1,22.1 47.27,22.1 47.68,21.69 48.59,21.69
  Top Layer w0.254: 63.38,27.58 62.05,27.58 61.99,27.64 ; 67.1,22.99 64.91,22.99 63.43,24.46 C18.1 ; 63.39,25.69 63.49,25.79 63.49,27.32 ; 17.84,12 19.66,12 20.33,12.67 20.33,24.26 24.82,28.75
  Top Layer w0.305: v1(48.47,43.77) 48.47,44.54 50.35,46.43 51.12,46.43 51.18,46.48 51.46,46.48
  内层2 w0.254: 49.99,39.47 49.94,39.47 ; 49.94,39.47 61.9,27.52 ; 49.94,39.47 48.47,40.95 ; 48.47,40.95 v1(48.47,43.77) ; 48.47,40.95 48.41,41.01 v1(44.67,41.01) ; 24.75,28.74 24.78,28.71 39.41,28.71
  Bottom Layer w0.254: v1(44.67,41.01) 39.9,36.23 39.9,29.15 ; 43.59,22.07 43.64,22.12 44.76,22.12 44.94,22.3 44.94,23.83 39.9,28.87 39.9,29.15 ; 39.9,29.15 39.49,28.74 v1(39.45,28.74)
  Bottom Layer w0.508: 21.45,36.54 22.88,36.54 24.71,34.71 24.71,28.72
  vias: v1(24.76,28.72) v1(43.57,22.05) v1(61.89,27.59)
SW4: length 2.8
  Top Layer w0.5: C1.2 3.05,72.76 U2.1
UD2+: length 9.4
  Top Layer w0.254: USB2.8 6.78,12.64 ; 6.78,12.64 7.11,12.97 7.11,13.39 6.86,13.64 USB2.6 ; 6.78,12.64 7.55,11.86 11.94,11.86 12.19,11.61 U5.1
UD2-: length 11.9
  Top Layer w0.254: U5.2 13.46,11.61 12.7,12.37 8.76,12.37 7,14.14 USB2.5 6.17,14.15 5.59,14.15 5.21,13.77 5.21,13.52 5.52,13.21 6.11,13.21 USB2.7
UD+: length 31.4
  Top Layer w0.254: USB1.8 6.87,24.7 7.11,24.94 7.11,25.42 6.83,25.7 ; 6.83,25.7 10.66,25.7 14.35,29.39 20.95,29.39 24.13,32.56 24.13,34.85 25.76,36.48 U1.104 ; 6.83,25.7 USB1.6
UD-: length 31.9
  Top Layer w0.254: USB1.7 6.13,25.14 5.65,25.14 5.32,25.47 5.32,25.96 5.56,26.2 USB1.5 10.15,26.2 13.97,30.02 20.57,30.02 23.49,32.94 23.49,35.1 25.37,36.98 U1.103
